# EasyEDA Pro project MSXLinkCart.V1.epro

# Schematic CartridgeBoard

## Sheets
1 Power Supply: Board Name: V1; Create Date: 2025-08-08; Page Name: Power Supply; Project Name: OpenMSXSimpleCart; Schematic Name: CartridgeBoard; Update Date: 2025-08-09; Company: geek-logic.com; Drawed: Wells Wang; Page Size: A4; Reviewed: Wells Wang; Version: V1.0
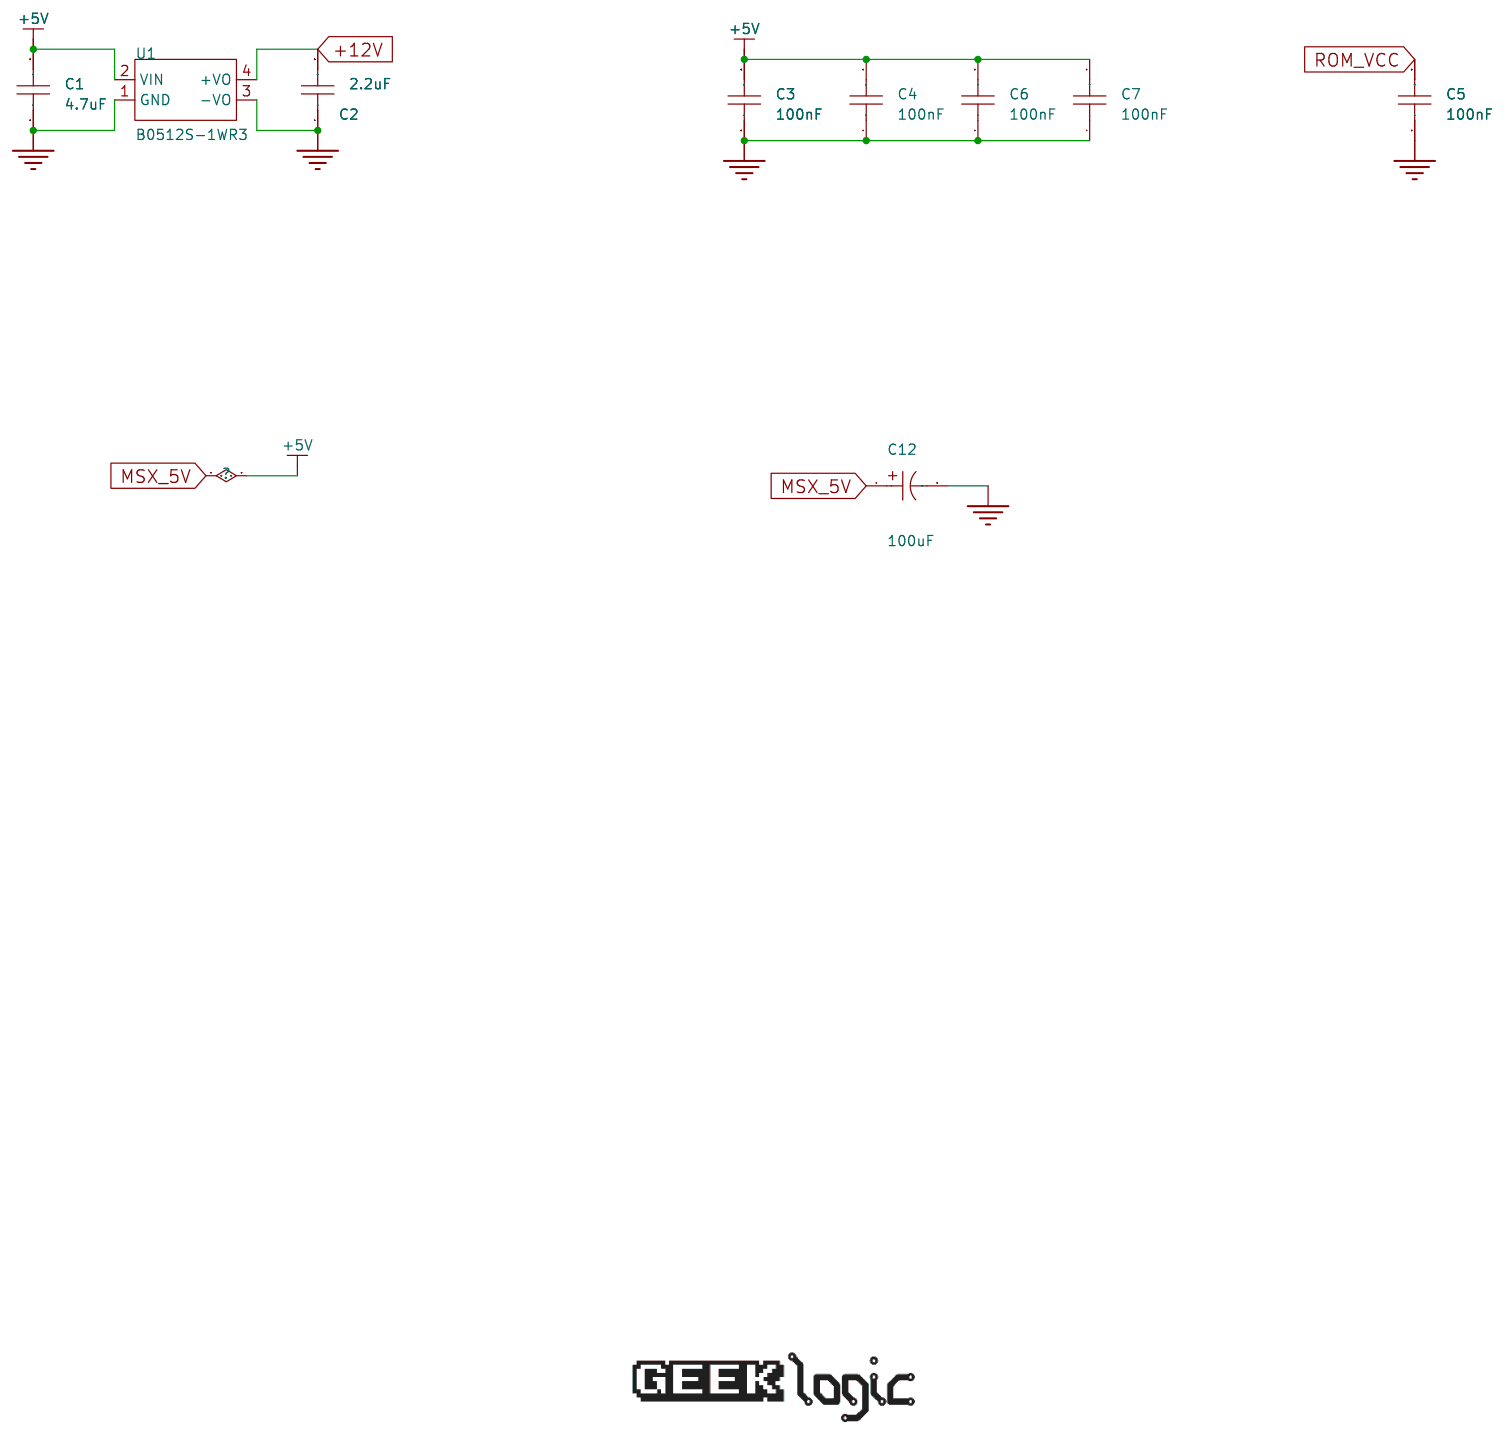
[diagram p0: Power Supply]
2 MCU: Page Name: MCU; Update Date: 2025-08-11
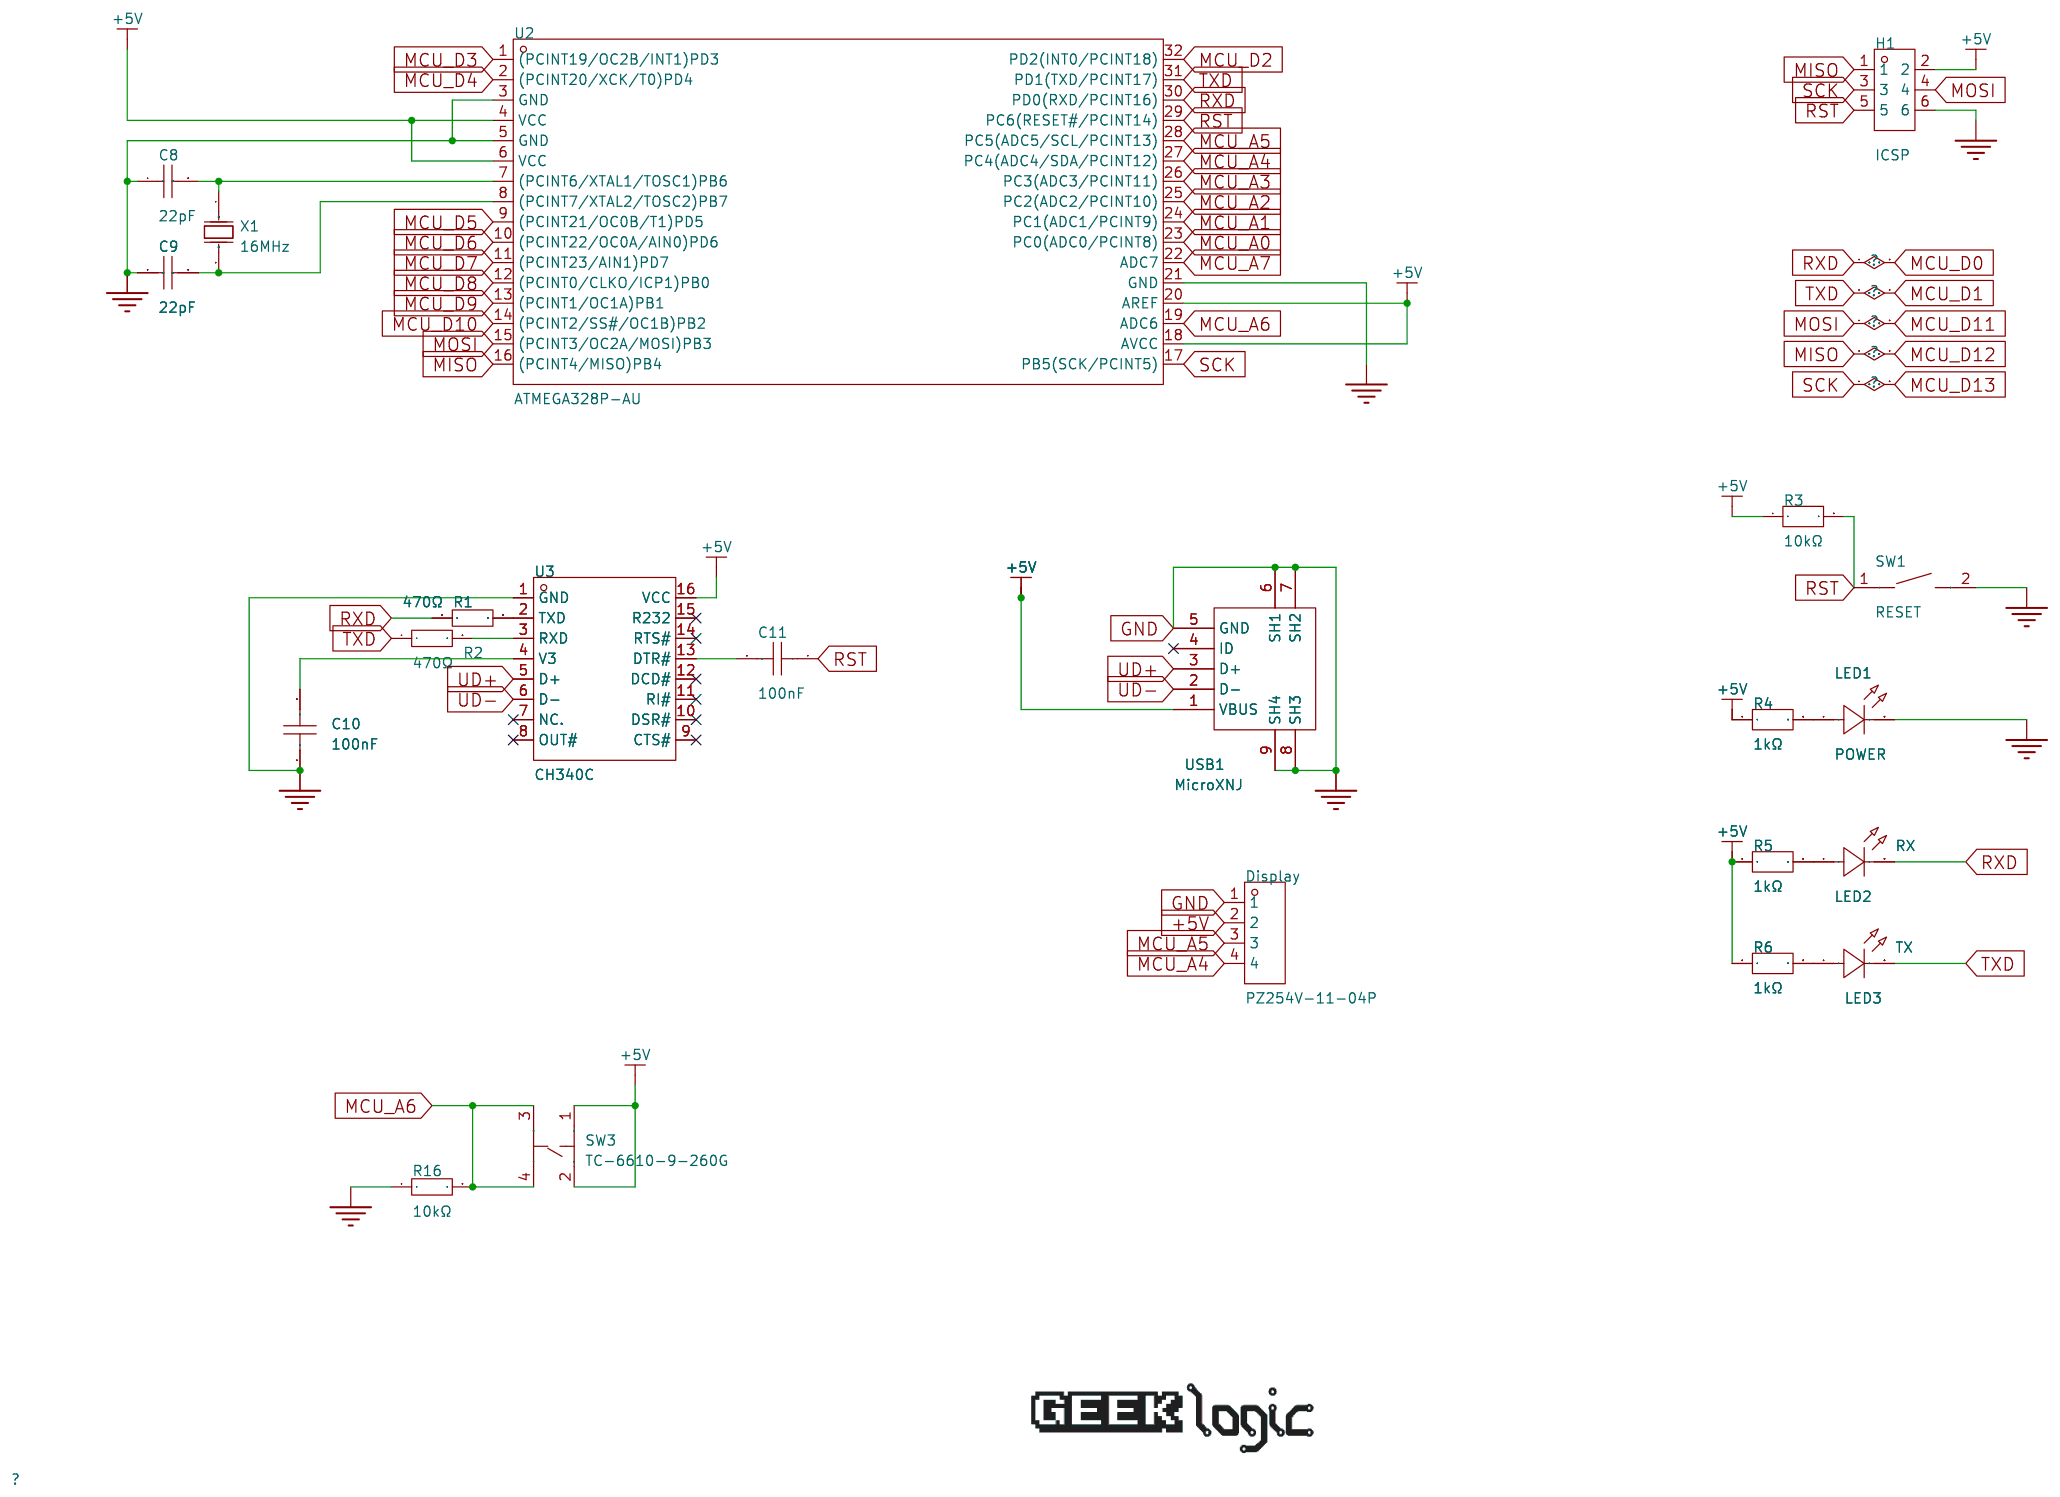
[diagram p1: MCU]
3 ROM: Page Name: ROM; Update Date: 2025-08-10
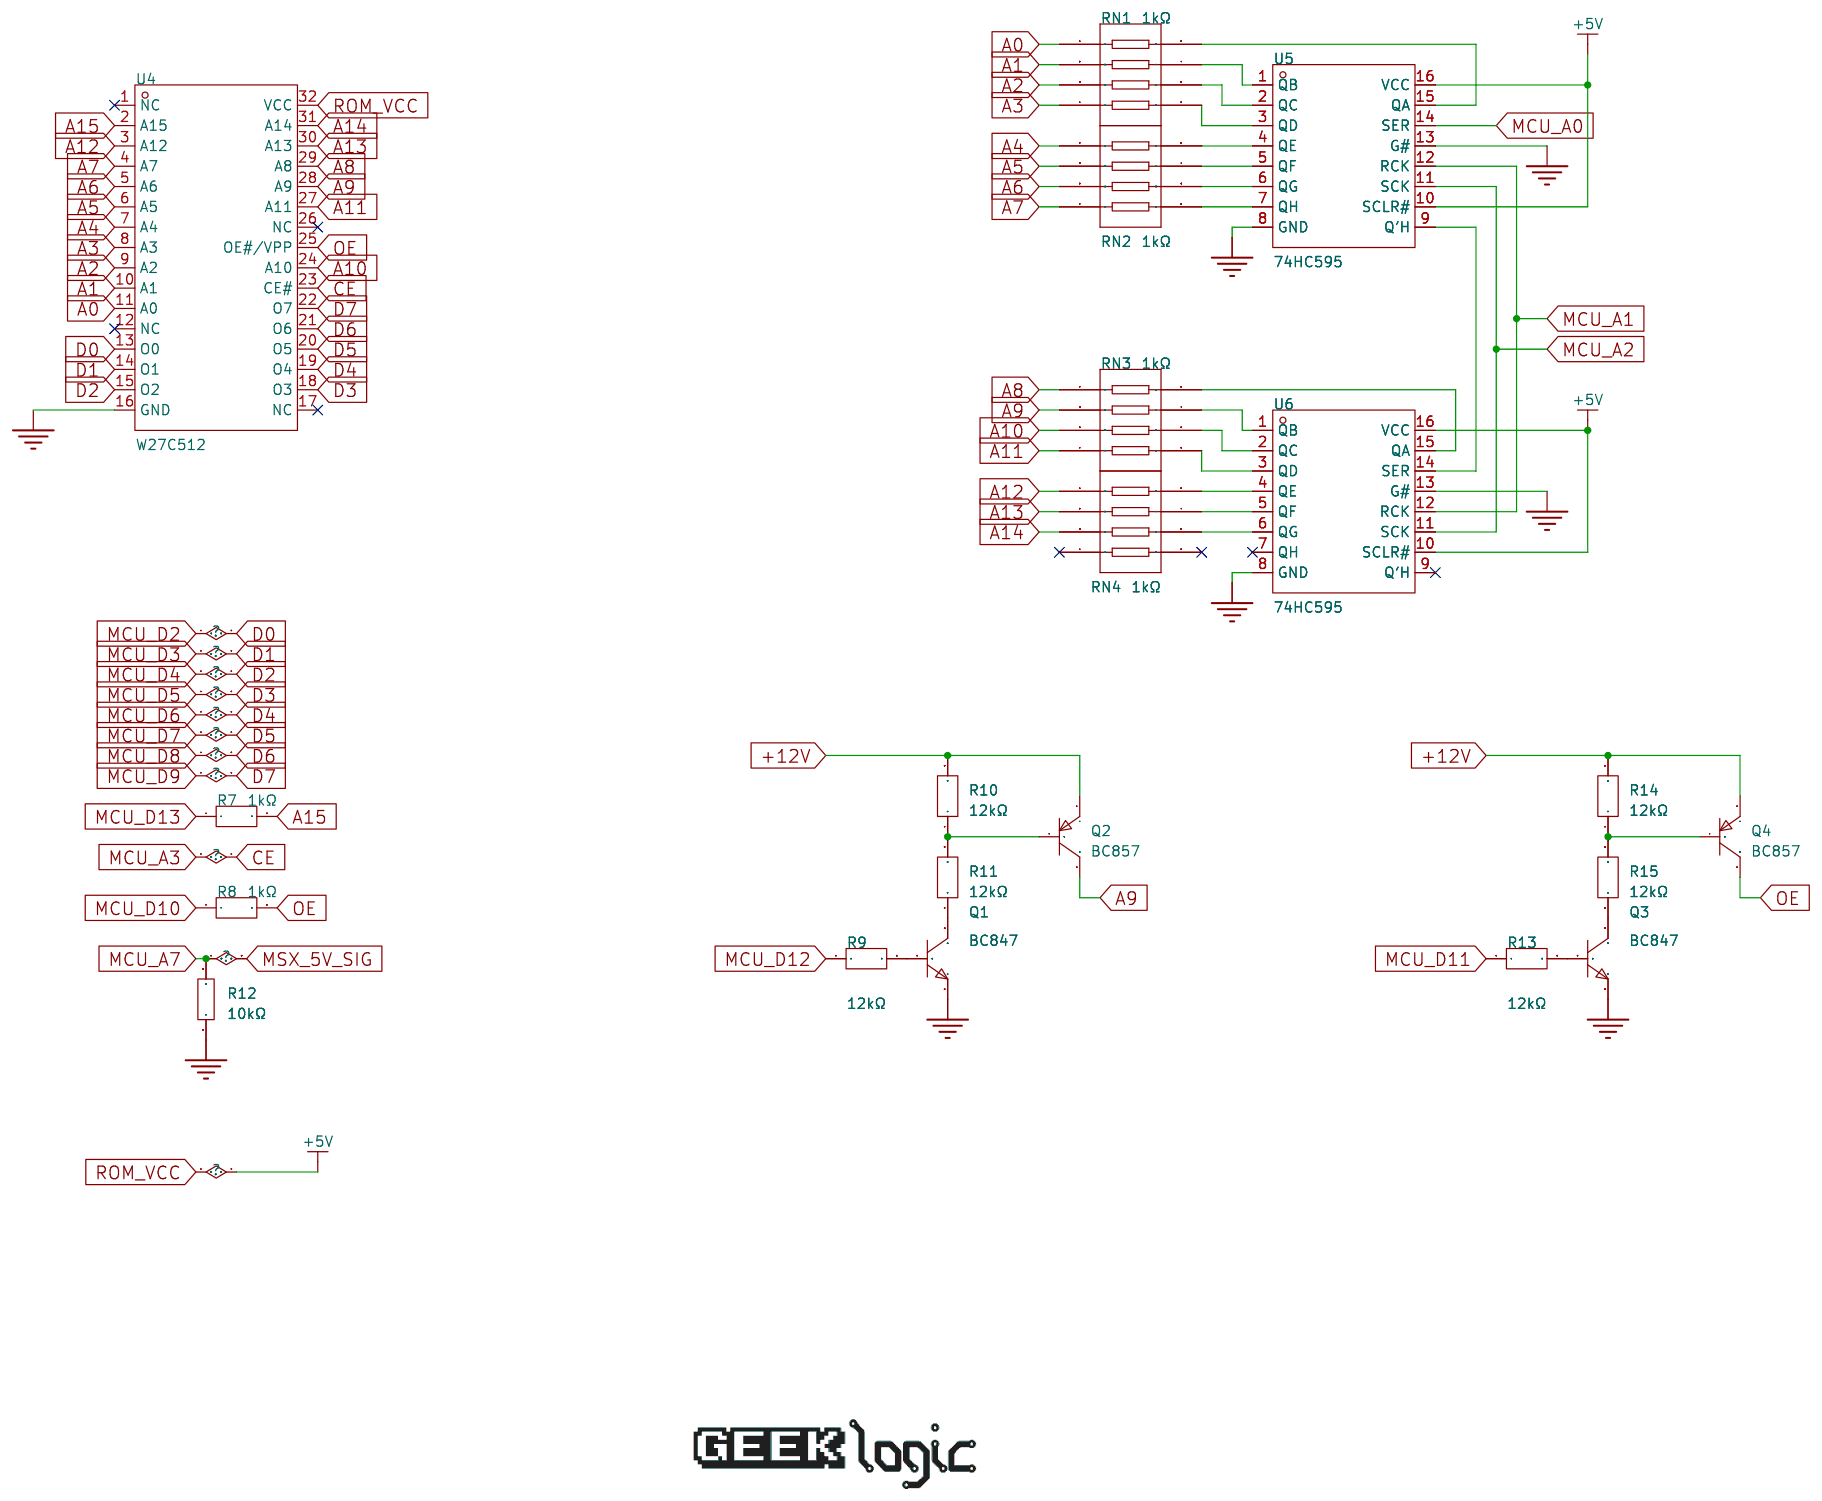
[diagram p2: ROM]
4 Slot Connector: Page Name: Slot Connector
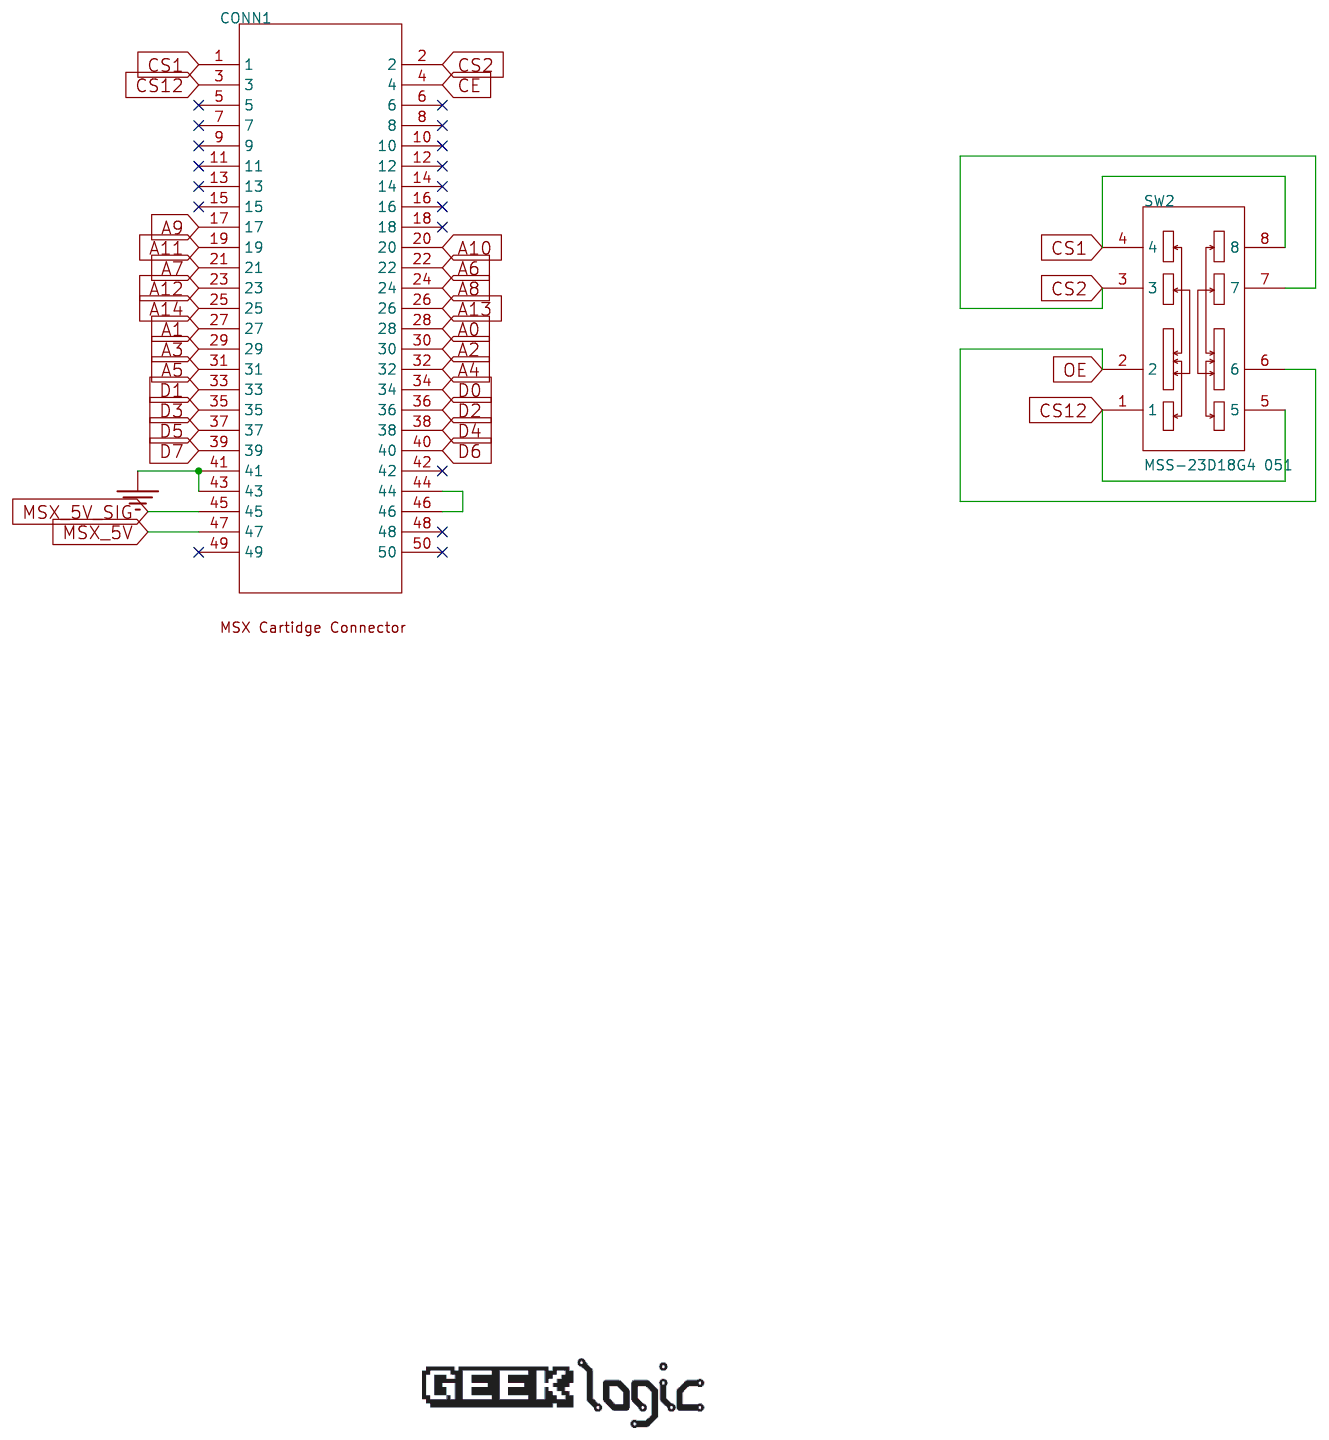
[diagram p3: Slot Connector]

## Parts
sheet MCU
C8  22pF  [C0805]
C9  22pF  [C0805]
C10  100nF  [C0805]
C11  100nF  [C0805]
Display  PZ254V-11-04P  [HDR-TH_4P-P2.54-V-M]
H1  ICSP  [HDR-TH_6P-P2.54-V-M-R2-C3-S2.54]
LED1  POWER  [LED0805-FD]
LED2  RX  [LED0805-FD]
LED3  TX  [LED0805-FD]
R1  470Ω  [R0805]
R2  470Ω  [R0805]
R3  10kΩ  [R0805]
R4  1kΩ  [R0805]
R5  1kΩ  [R0805]
R6  1kΩ  [R0805]
R16  10kΩ  [R0805]
SW1  RESET  [SW-SMD_L3.9-W3.0-P4.45]
SW3  TC-6610-9-260G  [SW-TH_4P-L5.0-W5.0-P4.50-LS6.5]
U2  ATMEGA328P-AU  [TQFP-32_L7.0-W7.0-P0.80-LS9.0-BL]
U3  CH340C  [SOP-16_L10.0-W3.9-P1.27-LS6.0-BL]
USB1  MicroXNJ  [MICRO-USB-SMD_MICROXNJ]
X1  16MHz  [OSC-TH_L10.0-W4.5-P5.00]
sheet Power Supply
C1  4.7uF  [C0805]
C2  2.2uF  [C0805]
C3  100nF  [C0805]
C4  100nF  [C0805]
C5  100nF  [C0805]
C6  100nF  [C0805]
C7  100nF  [C0805]
C12  100uF  [CAP-SMD_BD6.3-L6.6-W6.6-LS7.6-FD-1]
U1  B0512S-1WR3  [PWRM-TH_4P-L11.5-W6.1-P2.54_TME1212S]
sheet ROM
Q1  BC847  [SOT-23-3_L2.9-W1.3-P1.90-LS2.4-BR]
Q2  BC857  [SOT-23-3_L2.9-W1.3-P1.90-LS2.4-BR]
Q3  BC847  [SOT-23-3_L2.9-W1.3-P1.90-LS2.4-BR]
Q4  BC857  [SOT-23-3_L2.9-W1.3-P1.90-LS2.4-BR]
R7  1kΩ  [R0805]
R8  1kΩ  [R0805]
R9  12kΩ  [R0805]
R10  12kΩ  [R0805]
R11  12kΩ  [R0805]
R12  10kΩ  [R0805]
R13  12kΩ  [R0805]
R14  12kΩ  [R0805]
R15  12kΩ  [R0805]
RN1  1kΩ  [RES-ARRAY-SMD_0603-8P-L3.2-W1.6-BL]
RN2  1kΩ  [RES-ARRAY-SMD_0603-8P-L3.2-W1.6-BL]
RN3  1kΩ  [RES-ARRAY-SMD_0603-8P-L3.2-W1.6-BL]
RN4  1kΩ  [RES-ARRAY-SMD_0603-8P-L3.2-W1.6-BL]
U4  W27C512  [PLCC-32_L14.0-W11.4-P1.27-LS15.0-T]
U5  74HC595  [SOP-16_L9.9-W3.9-P1.27-LS6.0-BL]
U6  74HC595  [SOP-16_L9.9-W3.9-P1.27-LS6.0-BL]
sheet Slot Connector
CONN1  -  [MSX 50PIN EDGE CONNECTOR]
SW2  MSS-23D18G4 051  [SW-TH_HX-MSS-23D18GX051]

## Library data of the parts
C8 C9 = CL21C220JBANNNC: 容值:22pF;精度:±5%;额定电压:50V;材质(温度系数):C0G;; LCSC Part Name: 22pF ±5% 50V; Supplier Part: C1804; Manufacturer: SAMSUNG(三星); Supplier Footprint: 0805; JLCPCB Part Class: 基础库; Datasheet: https://atta.szlcsc.com/upload/public/pdf/source/20160218/1457707763339.pdf; Supplier: LCSC; Tolerance: ±5%; Voltage Rated: 50V; Temperature Coefficient: C0G
C3-C7 C10 C11 = FCC0805B104K500DT: 容值:100nF;精度:±10%;额定电压:50V;温度系数:X7R;; LCSC Part Name: 100nF ±10% 50V; Supplier Part: C5137467; Manufacturer: FOJAN(富捷); Supplier Footprint: 0805; JLCPCB Part Class: 扩展库; Datasheet: https://atta.szlcsc.com/upload/public/pdf/source/20220818/0EB3B7FB2F5648AC16609637FBA7DABE.pdf; Supplier: LCSC; Tolerance: ±10%; Voltage Rating: 50V; Temperature Coefficient: X7R
Display = PZ254V-11-04P: 插针结构:1x4P;间距:2.54mm;行距:-;圆针/方针:方针;安装类型:直插;排数:单排;总PIN位数:4P;额定电流:3A;额定电压:250V;配合针长度:6mm;塑高:2.5mm;端接针长度:3mm;触头材质:-;工作温度范围:-40℃~+105℃;颜色:黑色;; LCSC Part Name: 间距:2.54mm 1x4P 直插 方针; Supplier Part: C2691448; Manufacturer: XFCN(兴飞); Supplier Footprint: 插件,P=2.54mm; JLCPCB Part Class: 扩展库; Datasheet: https://atta.szlcsc.com/upload/public/pdf/source/20200309/C492403_F9F19131791D08044AD4F84F8E751A34.pdf; Supplier: LCSC; Pin Structure: 1x4P; Pitch: 2.54mm; Circluar Pins/Square Pins: 方针; Mounting Type: 直插; Number of Rows: 单排; Number of Pins: 4P; Current Rating (Max): 3A; Voltage Rating (Max): 250V; Length of Mating Pin: 6mm; Insulation Height: 2.5mm; Length of End Connection Pin: 3mm; Operating Temperature Range: -40℃~+105℃; Color: 黑色
H1 = PZ254V-12-6P: 插针结构:2x3P;间距:2.54mm;行距:2.54mm;圆针/方针:方针;安装类型:直插;排数:双排;总PIN位数:6P;额定电流:-;额定电压:-;配合针长度:6mm;塑高:2.5mm;端接针长度:3mm;触头材质:黄铜;触头镀层:-;工作温度范围:-40℃~+105℃;颜色:黑色;; LCSC Part Name: 间距:2.54mm 2x3P 直插 方针; Supplier Part: C492420; Manufacturer: XFCN(兴飞); Supplier Footprint: 插件,P=2.54mm; JLCPCB Part Class: 扩展库; Datasheet: https://atta.szlcsc.com/upload/public/pdf/source/20200309/C492420_BAECB307B001054C09D200388220EAE6.pdf; Supplier: LCSC; Pin Structure: 2x3P; Pitch: 2.54mm; Row Spacing: 2.54mm; Circluar Pins/Square Pins: 方针; Mounting Type: 直插; Number of Rows: 双排; Number of Pins: 6P; Length of Mating Pin: 6mm; Insulation Height: 2.5mm; Length of End Connection Pin: 3mm; Contact Material: 黄铜; Operating Temperature Range: -40℃~+105℃; Color: 黑色
LED1-LED3 = 17-21/GHC-XS1T2M/4T: Supplier Part: C2971978; Manufacturer: EVERLIGHT(亿光); Supplier Footprint: 0805; JLCPCB Part Class: 扩展库; Supplier: LCSC
R1 R2 = 0805W8F4700T5E: 电阻类型:厚膜电阻;阻值:470Ω;精度:±1%;功率:125mW;最大工作电压:150V;温度系数:±100ppm/℃;; LCSC Part Name: 470Ω ±1% 125mW 厚膜电阻; Supplier Part: C17710; Manufacturer: UNI-ROYAL(厚声); Supplier Footprint: 0805; JLCPCB Part Class: 基础库; Datasheet: https://atta.szlcsc.com/upload/public/pdf/source/20200306/C422600_1E6D84923E4A46A82E41ADD87F860B5C.pdf; Supplier: LCSC; Type: 厚膜电阻; Tolerance: ±1%; Power(Watts): 125mW; Overload Voltage (Max): 150V; Temperature Coefficient: ±100ppm/℃; Operating Temperature Range: -55℃~+155℃
R3 = ERJ-U06F1002V: 电阻类型:厚膜电阻;阻值:10kΩ;精度:±1%;功率:125mW;工作电压:-;温度系数:±100ppm/℃;; LCSC Part Name: 10kΩ ±1% 125mW 厚膜电阻; Supplier Part: C1013448; Manufacturer: PANASONIC(松下); Supplier Footprint: 0805; JLCPCB Part Class: Extended Part; Datasheet: https://atta.szlcsc.com/upload/public/pdf/source/20210606/C1013448_67383767FD3F9FEFE543BB803CCD7A76.pdf; Supplier: LCSC; Type: 厚膜电阻; Tolerance: ±1%; Power(Watts): 125mW; Temperature Coefficient: ±100ppm/℃; Operating Temperature: -55℃~+155℃
R4-R8 = ERJ-U06F1001V: 电阻类型:厚膜电阻;阻值:1kΩ;精度:±1%;功率:125mW;温度系数:±100ppm/℃;; LCSC Part Name: 1kΩ ±1% 125mW 厚膜电阻; Supplier Part: C4026491; Manufacturer: PANASONIC(松下); Supplier Footprint: 0805; JLCPCB Part Class: Extended Part; Datasheet: https://atta.szlcsc.com/upload/public/pdf/source/20240408/99A45AC14EAA6AC337D556AA79AC87B5.pdf; Supplier: LCSC; Type: 厚膜电阻; Tolerance: ±1%; Power(Watts): 125mW; Temperature Coefficient: ±100ppm/℃; Operating Temperature: -55℃~+155℃
R12 R16 = 0805W8F1002T5E_C17414: 电阻类型:厚膜电阻;阻值:10kΩ;精度:±1%;功率:125mW;工作电压:150V;温度系数:±100ppm/℃;; LCSC Part Name: 10kΩ ±1% 125mW 厚膜电阻; Supplier Part: C17414; Manufacturer: UNI-ROYAL(厚声); Manufacturer Part: 0805W8F1002T5E; Supplier Footprint: 0805; JLCPCB Part Class: 基础库; Datasheet: https://atta.szlcsc.com/upload/public/pdf/source/20200306/C422600_1E6D84923E4A46A82E41ADD87F860B5C.pdf; Supplier: LCSC; Type: 厚膜电阻; Tolerance: ±1%; Power(Watts): 125mW; Voltage-Supply(Max): 150V; Temperature Coefficient: ±100ppm/℃; Operating Temperature: -55℃~+155℃
SW1 = TS-1088-AR02016: 电路结构:单刀单掷;按钮形状:圆形按钮;作用力:160gf;安装方式:立贴;开关长度:4mm;开关宽度:3mm;开关高度:2mm;带支架:不带;触点电流:50mA;额定电压(DC):12V;绝缘电阻:100MΩ;机械寿命:10万次;; LCSC Part Name: 4*3*2mm 立贴 轻触开关; Supplier Part: C720477; Manufacturer: XUNPU(讯普); Supplier Footprint: SMD; JLCPCB Part Class: 基础库; Datasheet: https://atta.szlcsc.com/upload/public/pdf/source/20200810/C720475_60D09DD6C54279ADDB2DC25100F1CC11.pdf; Supplier: LCSC; Circuit: 单刀单掷; Actuator Style: 圆形按钮; Operating Force: 160gf; Mounting Style: 立贴; Switch Length: 4mm; Switch Width: 3mm; Switch Height: 2mm; Strike Gundam: 不带; Contact Current: 50mA; Voltage Rating (DC): 12V; Insulation Resistance: 100MΩ; Actuator/Cap Color: 黑色; Pin Style: SMD接片; Mechanical Life: 10万次; Operating Temperature: -30℃~+80℃
SW3 = TC-6610-9-260G: 电路结构:单刀单掷;按钮形状:圆形按钮;作用力:2.6N;安装方式:直插;开关长度:6mm;开关宽度:6mm;开关高度:9mm;带支架:不带支架;触点电流:50mA;额定电压:12V;带灯:无;工作寿命:10万次;; LCSC Part Name: 6*6*9mm 插件 轻触开关; Supplier Part: C2845257; Manufacturer: HCTL(华灿天禄); Supplier Footprint: 插件; JLCPCB Part Class: 扩展库; Datasheet: https://atta.szlcsc.com/upload/public/pdf/source/20230323/2FDB5D6FCE87B7593CD3E5FAC75F65D7.pdf; Supplier: LCSC; Circuit: 单刀单掷; Actuator Style: 圆形按钮; Operating Force: 2.6N; Mounting Type: 直插; Length: 6mm; Width: 6mm; Switch Height: 9mm; Strike Gundam: 不带支架; Contact Current: 50mA; Voltage Rating: 12V; Actuator/Cap Color: 黑色; With Lamp: 无; Termination Style: PC引脚; Life: 10万次; Operating Temperature: -25℃~+85℃
U2 = ATMEGA328P-AU: CPU内核:AVR;CPU最大主频:20MHz;应用领域:-;; LCSC Part Name: 基于AVR增强型RISC架构的低功耗CMOS 8位微控制器; Supplier Part: C14877; Manufacturer: MICROCHIP(美国微芯); Supplier Footprint: TQFP-32(7x7); JLCPCB Part Class: 扩展库; Datasheet: https://atta.szlcsc.com/upload/public/pdf/source/20140621/1457707095197.pdf; Supplier: LCSC; CPU Core: AVR; CPU Maximum Speed: 20MHz; Program Storage Size: 32KB; Program Memory Type: FLASH; EEPROM: 1KB; Number of I/O: 23; ADC (Bit): 10bit; Voltage - Supply: 1.8V~5.5V
U3 = CH340C: 应用功能:收发器;接口协议:USB 2.0;数据速率:2Mbps;; Supplier Part: C84681; Manufacturer: WCH(南京沁恒); Supplier Footprint: SOP-16; JLCPCB Part Class: 扩展库; Datasheet: https://atta.szlcsc.com/upload/public/pdf/source/20240619/63986D8440D4E5267A77ACD891CC4DE3.pdf; Supplier: LCSC; Applications Function: 收发器; Protocol: USB 2.0; Voltage - Supply: 3.3V；5V; Data Rate: 2Mbps
USB1 = MicroXNJ: 连接器类型:Micro-B;标准:USB 2.0;公母:母;安装方式:卧贴;触点数量:5P;端口数量:1;额定电流 - 电源:1.8A;工作温度范围:-20℃~+85℃;; LCSC Part Name: Micro-B 母 卧贴; Supplier Part: C404969; Manufacturer: SHOU HAN(首韩); Supplier Footprint: SMD; JLCPCB Part Class: 扩展库; Datasheet: https://atta.szlcsc.com/upload/public/pdf/source/20220415/2494EDFF499AF6F852F7C820374B6AF3.pdf; Supplier: LCSC; Connector Type: Micro-B; Standard: USB 2.0; Gender: 母; Mounting Style: 卧贴; Number of Contacts: 5P; Number of Ports: 1; Current Rating - Power (Max): 1.8A; Operating Temperature Range: -20℃~+85℃; Rated Voltage (Max): 30V; Connect-Disconnect Life: 5千次; Core Colour: 黑色
X1 = X49SD16MSD2SC: 晶振类型:直插晶振;频率:16MHz;常温频差:±20ppm;负载电容:20pF;频率稳定度:±30ppm;; LCSC Part Name: HC-49US 16MHZ 2P 49S 20PF ±20PPM -20~70℃ (±30PPM); Supplier Part: C16212; Manufacturer: YXC(扬兴晶振); Supplier Footprint: HC-49S; JLCPCB Part Class: 扩展库; Datasheet: https://atta.szlcsc.com/upload/public/pdf/source/20240329/977D7F2434F98B2BE33270BB9FF3D86D.pdf; Supplier: LCSC; Type: 直插晶振; Normal temperature Frequency Tolerance: ±20ppm; Load Capacitance: 20pF; Frequency Stability: ±30ppm; Operating Temperature: -20℃~+70℃
C1 = CGA0805X7R475K350MT: 容值:4.7uF;精度:±10%;额定电压:35V;材质(温度系数):X7R;; LCSC Part Name: 4.7uF ±10% 35V; Supplier Part: C6119943; Manufacturer: HRE(芯声); Supplier Footprint: 0805; JLCPCB Part Class: 扩展库; Supplier: LCSC; Tolerance: ±10%; Voltage Rated: 35V; Temperature Coefficient: X7R
C2 = CL21A225KBQNNNE: 容值:2.2uF;精度:±10%;额定电压:50V;材质(温度系数):X5R;; LCSC Part Name: 2.2uF ±10% 50V; Supplier Part: C377773; Manufacturer: SAMSUNG(三星); Supplier Footprint: 0805; JLCPCB Part Class: 基础库; Datasheet: https://atta.szlcsc.com/upload/public/pdf/source/20160218/1457707763339.pdf; Supplier: LCSC; Tolerance: ±10%; Voltage Rated: 50V; Temperature Coefficient: X5R
C12 = RVE100UF35V67RV0072: 容值:100uF;精度:±20%;额定电压:35V;纹波电流:230mA@120Hz;等效串联电阻:600mΩ@100kHz;; LCSC Part Name: 100uF ±20% 35V; Supplier Part: C2836437; Manufacturer: KNSCHA(科尼盛); Supplier Footprint: SMD,D6.3xL7.7mm; JLCPCB Part Class: 扩展库; Datasheet: https://atta.szlcsc.com/upload/public/pdf/source/20220719/B52EB46F8A1558448ED03D8B4CB3C24F.pdf; Supplier: LCSC; Tolerance: ±20%; Rated Voltage: 35V; Ripple Current: 230mA@120Hz; Equivalent Series Resistance(ESR): 600mΩ@100kHz; φD: 6.3mm; L: 7.7mm; Lifetime @ Temp: 2000hrs@105℃; Operating Temperature: -55℃~+105℃
U1 = B0512S-1WR3: B0512S-1WR3小体积,，高效率的微小功率,定电压输入,隔离非稳压单路输出,DC/DC模块电源；该系列产品是专门针对板上电源系统中需要产生一组与输入电源隔离的电压的应用场合而设计的。该产品适用于：1)输入电源的电压比较稳定（电压变化范围±10%Vin）;2)输入输出之间要求隔离（隔离电压≤1500VDC）；3)对输出电压稳定度要求不高；4)典型应用：纯数字电路场合，一般低频模拟电路场合，继电器驱动电路，数据交换电路场合等;; Supplier Part: C3031179; Manufacturer: YLPTEC(易川); Supplier Footprint: 插件; JLCPCB Part Class: 扩展库; Datasheet: https://atta.szlcsc.com/upload/public/pdf/source/20220507/D4A14754AF1A932D99A68D6BE212C636.pdf; Supplier: LCSC; Type: 升压型; Number of Channels: 1; Output Power: 1W; Voltage - Supply: 4.5V~5.5V; Conversion Efficiency: 89%; Output Voltage: 12V; Output Current(Max): 84mA; Capacitive Load(Max): 560uF; Isolation Voltage(Vrms): 1.5kV; Features: 短路保护；低功耗
Q1 Q3 = BC847: 晶体管类型:NPN;集电极电流(Ic):100mA;集射极击穿电压(Vceo):45V;功率(Pd):200mW;直流电流增益(hFE@Ic,Vce):110@2mA,5V;; LCSC Part Name: NPN 电流:100mA 耐压:45V; Supplier Part: C475630; Manufacturer: SHIKUES(时科); Supplier Footprint: SOT-23; JLCPCB Part Class: 扩展库; Datasheet: https://atta.szlcsc.com/upload/public/pdf/source/20200102/C475632_1BD5CEE5FD46587CE970DDC94CF96264.pdf; Supplier: LCSC; Transistor Type: NPN; Collector Current (Ic): 100mA; Collector-Emitter Breakdown Voltage (Vceo): 45V; Power Dissipation (Pd): 200mW; DC Current Gain (hFE@Ic,Vce): 110@2mA,5V; Transition Frequency (fT): 100MHz; Collector Cut-Off Current (Icbo): 100nA; Collector-Emitter Saturation Voltage (VCE(sat)@Ic,Ib): 500mV@100mA,5mA
Q2 Q4 = BC857: 晶体管类型:PNP;集电极电流(Ic):100mA;集射极击穿电压(Vceo):45V;功率(Pd):200mW;; LCSC Part Name: PNP 电流:100mA 耐压:45V; Supplier Part: C779725; Manufacturer: ZRE(治润); Supplier Footprint: SOT-23; JLCPCB Part Class: 扩展库; Datasheet: https://atta.szlcsc.com/upload/public/pdf/source/20201109/C779724_547EB5FA2CF407B243D5801159EBDFAB.pdf; Supplier: LCSC; Transistor Type: PNP; Collector Current (Ic): 100mA; Collector-Emitter Breakdown Voltage (Vceo): 45V; Power Dissipation (Pd): 200mW; Transition Frequency (fT): 100MHz; Collector Cut-Off Current (Icbo): 100nA; Collector-Emitter Saturation Voltage (VCE(sat)@Ic,Ib): 500mV@100mA,5mA
R9-R11 R13-R15 = ESR10EZPJ123: 电阻类型:厚膜电阻;阻值:12kΩ;精度:±5%;功率:400mW;最大工作电压:150V;温度系数:±200ppm/℃;; LCSC Part Name: 厚膜电阻 12kΩ ±5% 400mW; Supplier Part: C2077536; Manufacturer: ROHM(罗姆); Supplier Footprint: 0805; JLCPCB Part Class: 扩展库; Datasheet: https://atta.szlcsc.com/upload/public/pdf/source/20201013/C880931_34AADF1DD21EC1387392F0720F70D907.pdf; Supplier: LCSC; Type: 厚膜电阻; Tolerance: ±5%; Power(Watts): 400mW; Overload Voltage (Max): 150V; Temperature Coefficient: ±200ppm/℃; Operating Temperature Range: -55℃~+155℃
RN1-RN4 = 4D03WGJ0102T5E: 电阻器数:4;阻值:1kΩ;精度:±5%;单个元件功率:62.5mW;温度系数:±200ppm/℃;; LCSC Part Name: 1kΩ ±5%; Supplier Part: C20197; Manufacturer: UNI-ROYAL(厚声); Supplier Footprint: 0603x4; JLCPCB Part Class: 基础库; Datasheet: https://atta.szlcsc.com/upload/public/pdf/source/20191224/C474318_2527498AE30E813171187CCD28401A71.pdf; Supplier: LCSC; Number of Resistors: 4; Tolerance: ±5%; Power(Watts): 62.5mW; Temperature Coefficient: ±200ppm/℃; Number of Pins: 8
U4 = AT27C512R-45JU_C613963: AT27C512R是一款低功耗、高性能、524,288位、一次性可编程只读存储器（OTP EPROM），组织形式为64K x 8位。在正常读取模式操作中，它仅需一个5V电源。任何字节都可在小于45ns内访问，无需在高性能微处理器系统上使用降低速度的WAIT状态。; LCSC Part Name: AT27C512R-45JU; Supplier Part: C613963; Manufacturer: MICROCHIP(美国微芯); Supplier Footprint: PLCC-32(11.4x14); JLCPCB Part Class: 扩展库; Datasheet: https://item.szlcsc.com/datasheet/AT27C512R-45JU/643971.html; Supplier: LCSC
U5 U6 = 74HC595: 功能:串行至串行或并行;工作电压:2V~6V;元件数:1;每个元件位数:8;; Supplier Part: C18164493; Manufacturer: GR(国睿); Supplier Footprint: SOP-16; JLCPCB Part Class: 扩展库; Datasheet: https://atta.szlcsc.com/upload/public/pdf/source/20230915/F264A7C02E418D1689E15579DAA93EB8.pdf; Supplier: LCSC; Function: 串行至串行或并行; Supply Voltage: 2V~6V; Number of Elements: 1; Number of Bits per Element: 8; Output Type: 三态; Series: 74HC; Operating Temperature: -40℃~+85℃
CONN1 = MSX Cartridge Edge Connector
SW2 = MSS-23D18G4 051: 电路结构:双刀三掷;安装方式:直插;额定电流:100mA;额定电压:12V;工作寿命:1万次;; LCSC Part Name: 三档立式插件 8脚拨动 柄长4MM; Supplier Part: C7507436; Manufacturer: SHOU HAN(首韩); Supplier Footprint: DIP; JLCPCB Part Class: 扩展库; Datasheet: https://atta.szlcsc.com/upload/public/pdf/source/20250110/B51C719F20393CE8C900D786CCDBE29D.pdf; Supplier: LCSC; Circuit: 双刀三掷; Actuator Style: 矩形柱状; Termination Style: PC引脚; Mounting Type: 直插; Current Rating: 100mA; Voltage Rating: 12V; Life: 1万次; Operating Temperature: -10℃~+50℃

## Nets
+5V: C1.2 C3.2 C4.2 C5.2 C6.2 C7.2 C12.1 CONN1.47 Display.2 H1.2 R3.1 R4.1 R5.1 R6.1 SW3.1 SW3.2 U1.2(VIN) U2.4(VCC) U2.6(VCC) U2.18(AVCC) U2.20(AREF) U3.16(VCC) U4.32(VCC) U5.10(SCLR#) U5.16(VCC) U6.10(SCLR#) U6.16(VCC) USB1.1(VBUS)
+12V: C2.2 Q2.2(E) Q4.2(E) R10.2 R14.2 U1.4(+VO)
GND: C1.1 C2.1 C3.1 C4.1 C5.1 C6.1 C7.1 C8.1 C9.1 C10.1 C12.2 CONN1.41 CONN1.43 Display.1 H1.6 LED1.2(K) Q1.2(E) Q3.2(E) R12.1 R16.1 SW1.2 U1.1(GND) U1.3(-VO) U2.3(GND) U2.5(GND) U2.21(GND) U3.1(GND) U4.16(GND) U5.8(GND) U5.13(G#) U6.8(GND) U6.13(G#) USB1.5(GND) USB1.6(SH1) USB1.7(SH2) USB1.8(SH3) USB1.9(SH4)
A0: CONN1.28 RN1.1 U4.11(A0)
A1: CONN1.27 RN1.2 U4.10(A1)
A2: CONN1.30 RN1.3 U4.9(A2)
A3: CONN1.29 RN1.4 U4.8(A3)
A4: CONN1.32 RN2.1 U4.7(A4)
A5: CONN1.31 RN2.2 U4.6(A5)
A6: CONN1.22 RN2.3 U4.5(A6)
A7: CONN1.21 RN2.4 U4.4(A7)
A8: CONN1.24 RN3.1 U4.29(A8)
A9: CONN1.17 Q2.3(C) RN3.2 U4.28(A9)
A10: CONN1.20 RN3.3 U4.24(A10)
A11: CONN1.19 RN3.4 U4.27(A11)
A12: CONN1.23 RN4.1 U4.3(A12)
A13: CONN1.26 RN4.2 U4.30(A13)
A14: CONN1.25 RN4.3 U4.31(A14)
A15: R7.2 U4.2(A15)
CE: CONN1.4 U2.26(PC3(ADC3/PCINT11)) U4.23(CE#)
CS1: CONN1.1 SW2.4 SW2.8
CS2: CONN1.2 SW2.3 SW2.7
CS12: CONN1.3 SW2.1 SW2.5
D0: CONN1.34 U2.32(PD2(INT0/PCINT18)) U4.13(O0)
D1: CONN1.33 U2.1((PCINT19/OC2B/INT1)PD3) U4.14(O1)
D2: CONN1.36 U2.2((PCINT20/XCK/T0)PD4) U4.15(O2)
D3: CONN1.35 U2.9((PCINT21/OC0B/T1)PD5) U4.18(O3)
D4: CONN1.38 U2.10((PCINT22/OC0A/AIN0)PD6) U4.19(O4)
D5: CONN1.37 U2.11((PCINT23/AIN1)PD7) U4.20(O5)
D6: CONN1.40 U2.12((PCINT0/CLKO/ICP1)PB0) U4.21(O6)
D7: CONN1.39 U2.13((PCINT1/OC1A)PB1) U4.22(O7)
MCU_A0: U2.23(PC0(ADC0/PCINT8)) U5.14(SER)
MCU_A1: U2.24(PC1(ADC1/PCINT9)) U5.12(RCK) U6.12(RCK)
MCU_A2: U2.25(PC2(ADC2/PCINT10)) U5.11(SCK) U6.11(SCK)
MCU_A4: Display.4 U2.27(PC4(ADC4/SDA/PCINT12))
MCU_A5: Display.3 U2.28(PC5(ADC5/SCL/PCINT13))
MCU_A6: R16.2 SW3.3 SW3.4 U2.19(ADC6)
MCU_A7: CONN1.45 R12.2 U2.22(ADC7)
MCU_D0: LED2.2(K) R1.1 U2.30(PD0(RXD/PCINT16))
MCU_D1: LED3.2(K) R2.1 U2.31(PD1(TXD/PCINT17))
MCU_D10: R8.1 U2.14((PCINT2/SS#/OC1B)PB2)
MCU_D11: H1.4 R13.1 U2.15((PCINT3/OC2A/MOSI)PB3)
MCU_D12: H1.1 R9.1 U2.16((PCINT4/MISO)PB4)
MCU_D13: H1.3 R7.1 U2.17(PB5(SCK/PCINT5))
OE: Q4.3(C) R8.2 SW2.2 SW2.6 U4.25(OE#/VPP)
RST: C11.1 H1.5 R3.2 SW1.1 U2.29(PC6(RESET#/PCINT14))
UD+: U3.5(D+) USB1.3(D+)
UD-: U3.6(D-) USB1.2(D-)
$3N645: R1.2 U3.2(TXD)
$3N684: R2.2 U3.3(RXD)
$3N1092: C8.2 U2.7((PCINT6/XTAL1/TOSC1)PB6) X1.1(OSC1)
$3N1096: C9.2 U2.8((PCINT7/XTAL2/TOSC2)PB7) X1.2(OSC2)
$3N2382: C10.2 U3.4(V3)
$3N2455: C11.2 U3.13(DTR#)
$4N1047: U5.9(Q′H) U6.14(SER)
$4N1502: RN1.8 U5.15(QA)
$4N2627: Q2.1(B) R10.1 R11.2
$4N2636: Q1.3(C) R11.1
$4N2638: Q1.1(B) R9.2
$4N3090: Q4.1(B) R14.1 R15.2
$4N3092: Q3.3(C) R15.1
$4N3094: Q3.1(B) R13.2
$4N6754: RN3.8 U6.15(QA)
$4N6776: RN2.8 U5.4(QE)
$4N6780: RN2.7 U5.5(QF)
$4N6785: RN2.6 U5.6(QG)
$4N6790: RN2.5 U5.7(QH)
$4N6819: RN1.5 U5.3(QD)
$4N6825: RN1.6 U5.2(QC)
$4N6841: RN1.7 U5.1(QB)
$4N6896: RN3.5 U6.3(QD)
$4N6902: RN3.6 U6.2(QC)
$4N6909: RN3.7 U6.1(QB)
$4N6933: RN4.8 U6.4(QE)
$4N6938: RN4.7 U6.5(QF)
$4N6943: RN4.6 U6.6(QG)
$5N778: CONN1.44 CONN1.46
Net-(LED1-1): LED1.1(A) R4.2
Net-(LED2-1): LED2.1(A) R5.2
Net-(LED3-1): LED3.1(A) R6.2

Not connected (* = marked no-connect by the designer): CONN1 5* 6* 7* 8* 9* 10* 11* 12* 13* 14* 15* 16* 18* 42* 48* 49* 50*; RN4 4* 5*; U3 7(NC.)* 8(OUT#)* 9(CTS#)* 10(DSR#)* 11(RI#)* 12(DCD#)* 14(RTS#)* 15(R232)*; U4 1(NC)* 12(NC)* 17(NC)* 26(NC)*; U6 7(QH)* 9(Q′H)*; USB1 4(ID)*

# Board CartridgeBoard
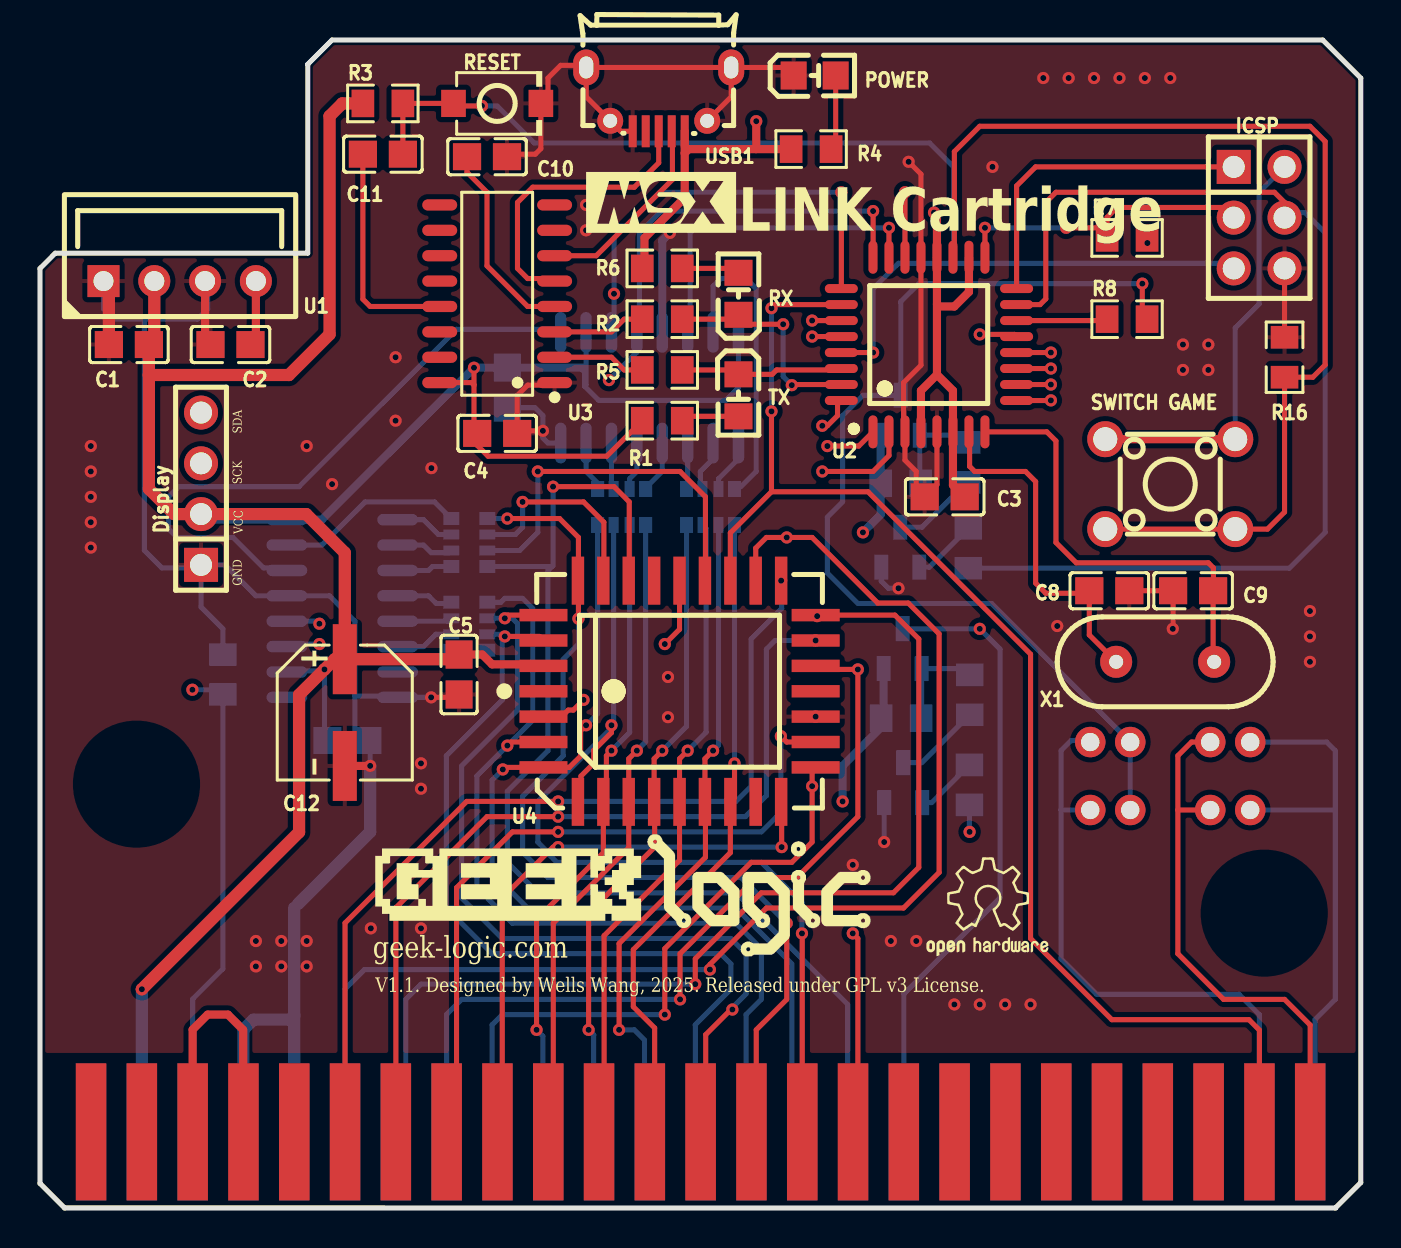
[diagram p4: board, top side]
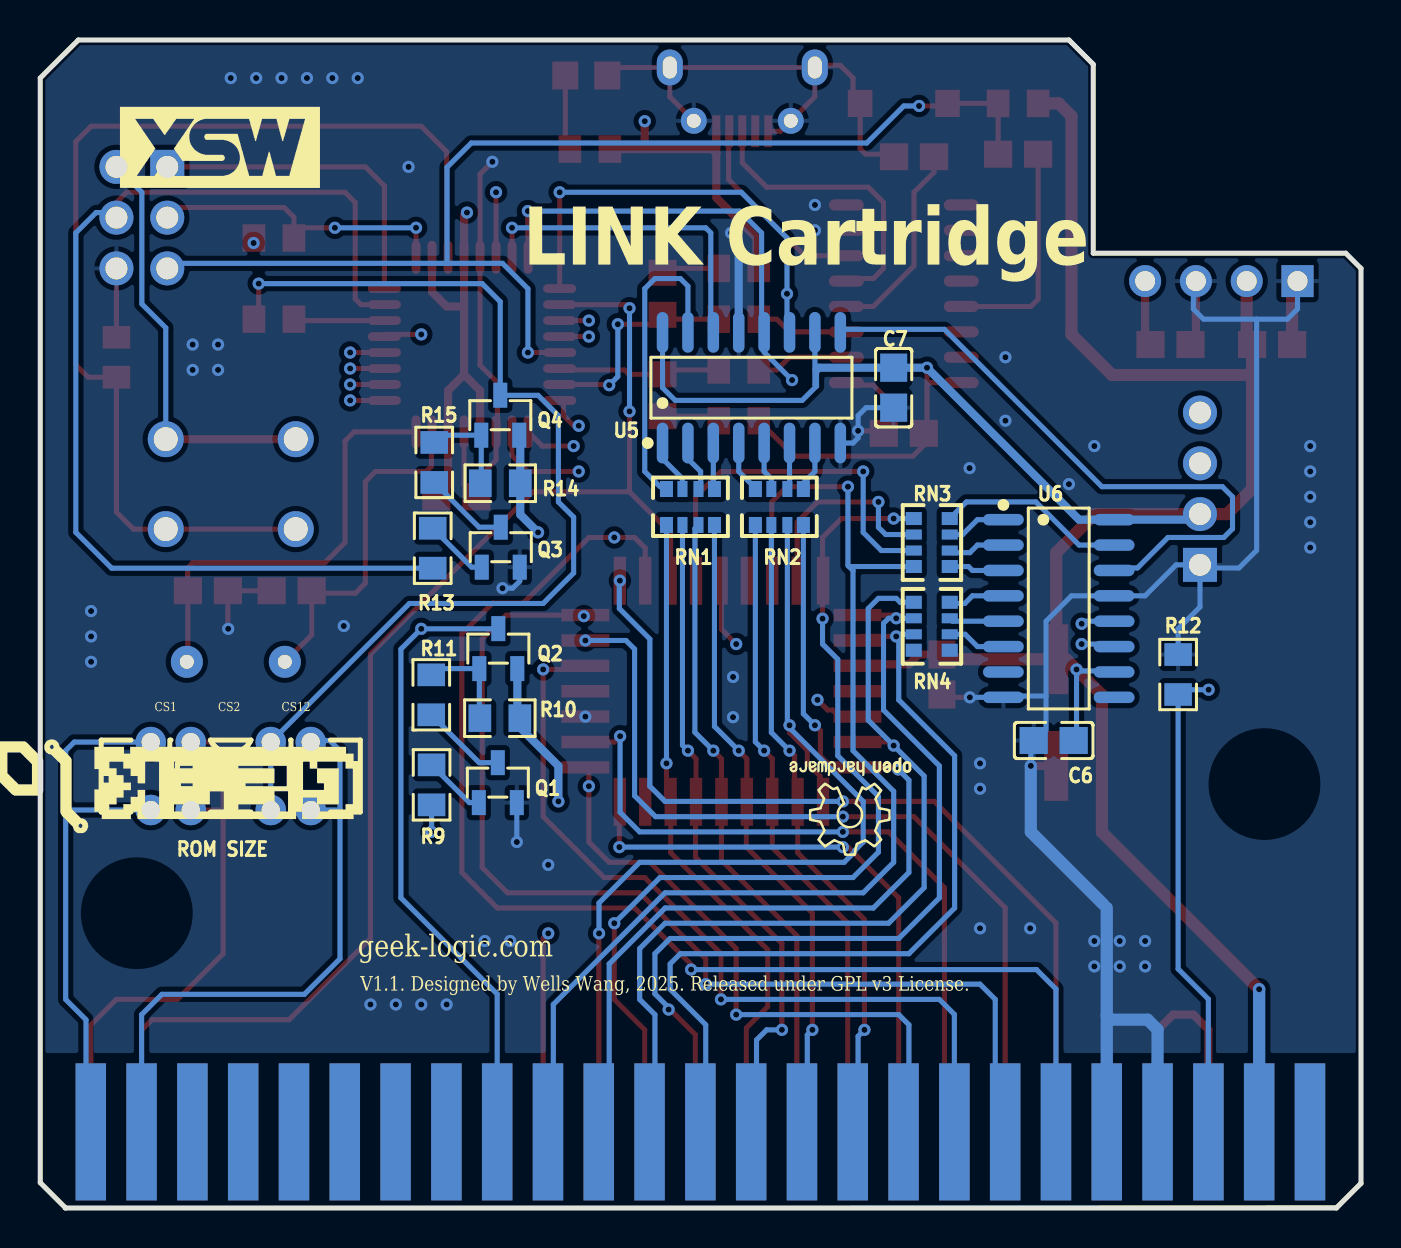
[diagram p5: board, bottom side, seen from below]

Outline 66.05 x 58.45 mm; copper layers: Top Layer, Inner1, Inner2, Bottom Layer. Coordinates in mm from the lower left corner of the outline.
Outline path: 0,47.02 0.76,47.78 13.39,47.78 13.39,57.23 14.6,58.45 64.13,58.45 66.04,56.54 66.04,1.27 64.78,0.01 64.78,0 1.23,0 0,1.23 0,47.02
Stack: Top Layer 0.035mm 外层铜厚1oz / Dielectric1 0.2104mm 7628 RC49% 8.6mil / Inner1 0.0152mm 内层铜厚 / Dielectric2 1.065mm 1.1mm H/HOZ Copper / Inner2 0.0152mm 内层铜厚 / Dielectric3 0.2104mm 7628 RC49% 8.6mil / Bottom Layer 0.035mm 外层铜厚1oz

## Design rules (mm)
template: JLCPCB Capability(Two Layers Board)
spacing copperThickness1oz (default): track to track 0.102, other pairs 0.152 to 0.3
spacing copperThickness2oz: track to track 0.203, other pairs 0.152 to 0.3
track width copperThickness1oz (default): min 0.127, default 0.254, max 2.54
track width copperThickness2oz: min 0.203, default 0.254, max 2.54
differential pair differentialPair (default): width min 0.127, default 0.254, max 2.54; gap min 0.152, default 0.152
via viaSize (default): diameter min 0.5, default 0.61, max 10; hole min 0.3, default 0.305, max 6.3

## Placement (name value [footprint] x y rotation side)
C1  4.7uF  [C0805]  4.44 43.21 0 top
C2  2.2uF  [C0805]  9.53 43.21 0 top
C3  100nF  [C0805]  45.24 35.59 0 top
C4  100nF  [C0805]  22.86 38.76 180 top
C5  100nF  [C0805]  20.96 26.7 90 top
C6  100nF  [C0805]  15.37 23.39 180 bottom
C7  100nF  [C0805]  23.37 41.05 90 bottom
C8  22pF  [C0805]  53.47 30.89 180 top
C9  22pF  [C0805]  57.66 30.89 0 top
C10  100nF  [C0805]  22.35 52.6 180 top
C11  100nF  [C0805]  17.15 52.73 180 top
C12  100uF  [CAP-SMD_BD6.3-L6.6-W6.6-LS7.6-FD-1]  15.24 24.79 270 top
CONN1  -  [MSX 50PIN EDGE CONNECTOR]  33.07 0.43 0 top
Display  PZ254V-11-04P  [HDR-TH_4P-P2.54-V-M]  8.05 35.99 90 top
ICSP  ICSP  [HDR-TH_6P-P2.54-V-M-R2-C3-S2.54]  60.96 49.56 270 top
POWER  POWER  [LED0805-FD]  38.74 56.67 180 top
Q1  BC847  [SOT-23-3_L2.9-W1.3-P1.90-LS2.4-BR]  43.16 21.28 270 bottom
Q2  BC857  [SOT-23-3_L2.9-W1.3-P1.90-LS2.4-BR]  43.14 27.99 270 bottom
Q3  BC847  [SOT-23-3_L2.9-W1.3-P1.90-LS2.4-BR]  43.01 33.07 270 bottom
Q4  BC857  [SOT-23-3_L2.9-W1.3-P1.90-LS2.4-BR]  43.04 39.67 270 bottom
R1  470Ω  [R0805]  31.12 41.94 180 top
R2  470Ω  [R0805]  31.12 44.48 180 top
R3  10kΩ  [R0805]  17.15 55.27 0 top
R4  1kΩ  [R0805]  38.56 52.98 0 top
R5  1kΩ  [R0805]  31.12 39.4 0 top
R6  1kΩ  [R0805]  31.12 47.02 0 top
R7  1kΩ  [R0805]  54.36 48.54 0 top
R8  1kΩ  [R0805]  54.36 44.48 0 top
R9  12kΩ  [R0805]  46.47 21.17 90 bottom
R10  12kΩ  [R0805]  43.06 24.51 180 bottom
R11  12kΩ  [R0805]  46.49 25.68 90 bottom
R12  10kΩ  [R0805]  9.14 26.7 270 bottom
R13  12kΩ  [R0805]  46.42 33.02 90 bottom
R14  12kΩ  [R0805]  43.04 36.27 180 bottom
R15  12kΩ  [R0805]  46.34 37.31 90 bottom
R16  10kΩ  [R0805]  62.23 42.57 270 top
RESET  RESET  [SW-SMD_L3.9-W3.0-P4.45]  22.86 55.27 0 top
RN1  1kΩ  [RES-ARRAY-SMD_0603-8P-L3.2-W1.6-BL]  33.53 35.08 180 bottom
RN2  1kΩ  [RES-ARRAY-SMD_0603-8P-L3.2-W1.6-BL]  29.08 35.08 180 bottom
RN3  1kΩ  [RES-ARRAY-SMD_0603-8P-L3.2-W1.6-BL]  21.46 33.3 270 bottom
RN4  1kΩ  [RES-ARRAY-SMD_0603-8P-L3.2-W1.6-BL]  21.46 29.11 270 bottom
ROM SIZE  MSS-23D18G4 051  [SW-TH_HX-MSS-23D18GX051]  56.51 21.62 0 bottom
RX  TX  [LED0805-FD]  34.93 45.75 270 top
SWITCH GAME  TC-6610-9-260G  [SW-TH_4P-L5.0-W5.0-P4.50-LS6.5]  56.51 36.22 0 top
TX  RX  [LED0805-FD]  34.93 40.67 90 top
U1  B0512S-1WR3  [PWRM-TH_4P-L11.5-W6.1-P2.54_TME1212S]  6.98 46.38 0 top
U2  ATMEGA328P-AU  [TQFP-32_L7.0-W7.0-P0.80-LS9.0-BL]  44.45 43.21 0 top
U3  CH340C  [SOP-16_L10.0-W3.9-P1.27-LS6.0-BL]  22.86 45.75 90 top
U4  W27C512  [PLCC-32_L14.0-W11.4-P1.27-LS15.0-T]  31.98 25.86 90 top
U5  74HC595  [SOP-16_L9.9-W3.9-P1.27-LS6.0-BL]  30.48 41.05 180 bottom
U6  74HC595  [SOP-16_L9.9-W3.9-P1.27-LS6.0-BL]  15.11 30 270 bottom
USB1  MicroXNJ  [MICRO-USB-SMD_MICROXNJ]  30.94 55.47 180 top
X1  16MHz  [OSC-TH_L10.0-W4.5-P5.00]  56.26 27.33 90 top

## Footprints (pads in the part's own frame, mm; a bottom-side part is the same pattern mirrored in y, then rotated)
C0805
  rect 1.41x1.35 smd: 1(-1,0) 2(1,0)
CAP-SMD_BD6.3-L6.6-W6.6-LS7.6-FD-1
  rect 3.5x1.2 smd: 1(-2.67,0) 2(2.67,0)
HDR-TH_4P-P2.54-V-M
  rect 1.7x1.7 hole 1.1: 1(-3.81,0)
  round 1.7 hole 1.1: 2(-1.27,0) 3(1.27,0) 4(3.81,0)
HDR-TH_6P-P2.54-V-M-R2-C3-S2.54
  rect 1.7x1.7 hole 1.1: 1(-2.54,-1.27)
  round 1.7 hole 1.1: 2(-2.54,1.27) 3(0,-1.27) 4(0,1.27) 5(2.54,-1.27) 6(2.54,1.27)
LED0805-FD
  rect 1.3x1.399 smd: 1(-1.05,0) 2(1.05,0)
MICRO-USB-SMD_MICROXNJ
  rect 0.4x1.6 smd: 1(-1.3,1.597) 2(-0.65,1.597) 3(0,1.597) 4(0.65,1.597) 5(1.3,1.597)
  round 1.3 hole 0.7: 6(2.425,1.074) 9(-2.425,1.073)
  oval 1.3x1.8 hole 0.7x1.1: 7(3.625,-1.597) 8(-3.625,-1.597)
MSX 50PIN EDGE CONNECTOR
  custom 1.524x6.858 smd far side: 1(30.442,3.378) 3(27.902,3.378) 5(25.362,3.378) 7(22.822,3.378) 9(20.282,3.378) 11(17.742,3.378) 13(15.202,3.378) 15(12.662,3.378) 17(10.122,3.378) 19(7.582,3.378) 21(5.042,3.378) 23(2.502,3.378) 25(-0.038,3.378) 27(-2.578,3.378) 29(-5.118,3.378) 31(-7.658,3.378) 33(-10.198,3.378) 35(-12.738,3.378) 37(-15.278,3.378) 39(-17.818,3.378) 41(-20.358,3.378) 43(-22.898,3.378) 45(-25.438,3.378) 47(-27.978,3.378) 49(-30.518,3.378)
  custom 1.524x6.858 smd: 2(30.442,3.378) 4(27.902,3.378) 6(25.362,3.378) 8(22.822,3.378) 10(20.282,3.378) 12(17.742,3.378) 14(15.202,3.378) 16(12.662,3.378) 18(10.122,3.378) 20(7.582,3.378) 22(5.042,3.378) 24(2.502,3.378) 26(-0.038,3.378) 28(-2.578,3.378) 30(-5.118,3.378) 32(-7.658,3.378) 34(-10.198,3.378) 36(-12.738,3.378) 38(-15.278,3.378) 40(-17.818,3.378) 42(-20.358,3.378) 44(-22.898,3.378) 46(-25.438,3.378) 48(-27.978,3.378) 50(-30.518,3.378)
OSC-TH_L10.0-W4.5-P5.00
  round 1.6 hole 0.7: 1(0,2.45) 2(0,-2.45)
PLCC-32_L14.0-W11.4-P1.27-LS15.0-T
  rect 0.62x2.4 smd: 1(0,6.805) 2(-1.27,6.805) 3(-2.54,6.805) 4(-3.81,6.805) 14(-3.81,-6.805) 15(-2.54,-6.805) 16(-1.27,-6.805) 17(0,-6.805) 18(1.27,-6.805) 19(2.54,-6.805) 20(3.81,-6.805) 30(3.81,6.805) 31(2.54,6.805) 32(1.27,6.805)
  rect 2.4x0.62 smd: 5(-5.535,5.08) 6(-5.535,3.81) 7(-5.535,2.54) 8(-5.535,1.27) 9(-5.535,0) 10(-5.535,-1.27) 11(-5.535,-2.54) 12(-5.535,-3.81) 13(-5.535,-5.08) 21(5.535,-5.08) 22(5.535,-3.81) 23(5.535,-2.54) 24(5.535,-1.27) 25(5.535,0) 26(5.535,1.27) 27(5.535,2.54) 28(5.535,3.81) 29(5.535,5.08)
PWRM-TH_4P-L11.5-W6.1-P2.54_TME1212S
  rect 1.6x1.6 hole 1: 1(-3.81,0)
  round 1.6 hole 1: 2(-1.27,0) 3(1.27,0) 4(3.81,0)
R0805
  rect 1.133x1.377 smd: 1(-1,0) 2(1,0)
RES-ARRAY-SMD_0603-8P-L3.2-W1.6-BL
  rect 0.65x0.8 smd: 1(-1.2,-0.9) 4(1.2,-0.9) 5(1.2,0.9) 8(-1.2,0.9)
  rect 0.5x0.8 smd: 2(-0.4,-0.9) 3(0.4,-0.9) 6(0.4,0.9) 7(-0.4,0.9)
SOP-16_L9.9-W3.9-P1.27-LS6.0-BL
  oval 0.574x2.038 smd: 1(-4.445,-2.769) 2(-3.175,-2.769) 3(-1.905,-2.769) 4(-0.635,-2.769) 5(0.635,-2.769) 6(1.905,-2.769) 7(3.175,-2.769) 8(4.445,-2.769) 9(4.445,2.769) 10(3.175,2.769) 11(1.905,2.769) 12(0.635,2.769) 13(-0.635,2.769) 14(-1.905,2.769) 15(-3.175,2.769) 16(-4.445,2.769)
SOP-16_L10.0-W3.9-P1.27-LS6.0-BL
  oval 0.56x1.745 smd: 1(-4.445,-2.873) 2(-3.175,-2.873) 3(-1.905,-2.873) 4(-0.635,-2.873) 5(0.635,-2.873) 6(1.905,-2.873) 7(3.175,-2.873) 8(4.445,-2.873) 9(4.445,2.873) 10(3.175,2.873) 11(1.905,2.873) 12(0.635,2.873) 13(-0.635,2.873) 14(-1.905,2.873) 15(-3.175,2.873) 16(-4.445,2.873)
SOT-23-3_L2.9-W1.3-P1.90-LS2.4-BR
  rect 1.25x0.7 smd: 1(1,-0.95) 2(1,0.95) 3(-1,0)
SW-SMD_L3.9-W3.0-P4.45
  rect 1.23x1.36 smd: 1(-2.185,0) 2(2.185,0)
SW-TH_4P-L5.0-W5.0-P4.50-LS6.5
  round 1.8 hole 1.2: 1(-3.25,2.25) 2(3.25,2.25) 3(-3.25,-2.25) 4(3.25,-2.25)
SW-TH_HX-MSS-23D18GX051
  round 1.524 hole 0.914: 1(-4,1.7) 2(-2,1.7) 3(2,1.7) 4(4,1.7) 5(-4,-1.7) 6(-2,-1.7) 7(2,-1.7) 8(4,-1.7)
TQFP-32_L7.0-W7.0-P0.80-LS9.0-BL
  oval 0.45x1.65 smd: 1(-2.8,-4.369) 2(-2,-4.369) 3(-1.2,-4.369) 4(-0.4,-4.369) 5(0.4,-4.369) 6(1.2,-4.369) 7(2,-4.369) 8(2.8,-4.369) 17(2.8,4.369) 18(2,4.369) 19(1.2,4.369) 20(0.4,4.369) 21(-0.4,4.369) 22(-1.2,4.369) 23(-2,4.369) 24(-2.8,4.369)
  oval 1.65x0.45 smd: 9(4.381,-2.8) 10(4.381,-2) 11(4.381,-1.2) 12(4.381,-0.4) 13(4.381,0.4) 14(4.381,1.2) 15(4.381,2) 16(4.381,2.8) 25(-4.381,2.8) 26(-4.381,2) 27(-4.381,1.2) 28(-4.381,0.4) 29(-4.381,-0.4) 30(-4.381,-1.2) 31(-4.381,-2) 32(-4.381,-2.8)

## Nets
As in the schematic, except:
+5V: C1.2 C3.2 C4.2 C5.2 C6.2 C7.2 C12.1 CONN1.47 Display.2 ICSP.2 R3.1 R4.1 R5.1 R6.1 SWITCH GAME.1 SWITCH GAME.2 U1.2 U2.4 U2.6 U2.18 U2.20 U3.16 U4.32 U5.10 U5.16 U6.10 U6.16 USB1.1
GND: C1.1 C2.1 C3.1 C4.1 C5.1 C6.1 C7.1 C8.1 C9.1 C10.1 C12.2 CONN1.41 CONN1.43 Display.1 ICSP.6 POWER.2 Q1.2 Q3.2 R12.1 R16.1 RESET.2 U1.1 U1.3 U2.3 U2.5 U2.21 U3.1 U4.16 U5.8 U5.13 U6.8 U6.13 USB1.5 USB1.6 USB1.7 USB1.8 USB1.9
CS1: CONN1.1 ROM SIZE.4 ROM SIZE.8
CS2: CONN1.2 ROM SIZE.3 ROM SIZE.7
CS12: CONN1.3 ROM SIZE.1 ROM SIZE.5
MCU_A6: R16.2 SWITCH GAME.3 SWITCH GAME.4 U2.19
MCU_D0: R1.1 TX.2 U2.30
MCU_D1: R2.1 RX.2 U2.31
MCU_D11: ICSP.4 R13.1 U2.15
MCU_D12: ICSP.1 R9.1 U2.16
MCU_D13: ICSP.3 R7.1 U2.17
OE: Q4.3 R8.2 ROM SIZE.2 ROM SIZE.6 U4.25
RST: C11.1 ICSP.5 R3.2 RESET.1 U2.29
$3N2905: POWER.1 R4.2
$3N3049: R5.2 TX.1
$3N3143: R6.2 RX.1

Pads without a net: CONN1 5 6 7 8 9 10 11 12 13 14 15 16 18 42 48 49 50; RN4 4 5; U3 7 8 9 10 11 12 14 15; U4 1 12 17 26; U6 7 9; USB1 4

## Via types
v1: diameter 0.61, hole 0.305, Top Layer to Bottom Layer, 135 vias

## Routing (per net, layer and track width the routed paths; a pad name or vN(x,y) marks a point on that pad's centre or on a via; arc(x,y) is an arc through that point)
+5V: length 271.2
  Top Layer w0.254: 44.97,45.11 44.85,45.23 ; R5.1 28.34,37.62 22.41,37.62 21.86,38.16 C4.2 21.7,38.92 21.7,41.18 ; U3.16 21.58,41.3 21.7,41.18 ; 21.7,41.18 v1(21.7,42.05)
  Top Layer w0.406: C5.2 22.11,27.7 22.61,27.2 25.1,27.2 U4.32 ; R6.1 30.23,47.13 30.23,48.54 32.24,50.55 32.24,52.78 ; U2.18 46.45,45.84 45.72,45.11 44.97,45.11 ; 32.24,53.88 32.24,52.78 ; 32.24,52.78 32.44,52.98 35.8,52.98 ; C3.2 45.65,36.17 U2.6 45.65,40.9 44.85,41.7 ; SWITCH GAME.1 SWITCH GAME.2 ; v1(35.81,54.38) 35.81,53 35.8,52.98 ; 44.85,41.7 U2.20 44.85,49.66 v1(44.7,49.81) ; 44.85,41.7 44.05,40.9 U2.4 ; 35.8,52.98 R4.1
  Top Layer w0.61: 5.44,41.68 12.45,41.68 14.48,43.71 14.48,54.64 15.11,55.27 R3.1 ; 5.44,41.68 C1.2 5.72,43.48 U1.2 ; 5.44,41.68 5.44,35.98 6.71,34.72 Display.2 13.31,34.72 15.24,32.79 C12.1 ; C12.1 20.72,27.46 C5.2 ; C12.1 14.74,27.46 v1(14.22,26.95) 12.95,25.68 12.95,18.81 v1(5.09,10.95)
  Inner2 w0.406: ICSP.2 62.23,53.62 61.47,54.38 v1(35.81,54.38) ; v1(21.7,42.05) 21.7,39.54 23.37,37.87 32.51,37.87 35.05,40.41 35.05,46.64 36.44,48.03 44.2,48.03 44.7,48.54 v1(44.7,49.81) 44.7,54.33
  Bottom Layer w0.254: SWITCH GAME.2 59.76,44.04 60.96,45.24 60.96,50.83 ICSP.2 ; 27.22,41.13 27.94,40.41 34.29,40.41 34.93,41.05 U5.16 ; 27.22,41.13 27.31,41.21 U5.10 ; 27.22,41.13 27.22,41.94 ; U6.10 12.4,26.88 14.04,26.88 14.22,26.7 14.22,23.54 C6.2
  Bottom Layer w0.406: Display.2 8.33,34.44 U6.16 14.1,34.44 v1(21.7,42.05) C7.2 27.11,42.05 27.22,41.94
  Bottom Layer w0.61: CONN1.47 v1(5.09,10.95)
+12V: length 69.2
  Top Layer w0.406: U1.4 10.79,43.48 C2.2
  Inner2 w0.406: U1.4 12.73,46.38 16.26,42.85 16.26,38.13 21.78,32.6 41.13,32.6 41.15,32.59 ; v1(41.15,33.81) 41.15,32.59 ; 41.15,32.59 41.15,30.51 41.66,30 41.66,21.87 v1(40.13,20.35)
  Bottom Layer w0.406: v1(41.15,33.81) 42.04,34.7 R14.2 42.04,38.62 Q4.2 ; Q2.2 42.19,24.64 R10.2 42.06,24.05 40.13,22.12 v1(40.13,20.35)
GND: length 312
  Top Layer w0.254: C5.1 20.81,25.55 v1(19.56,25.55) ; C10.1 23.48,52.73 24.76,52.73 25.04,53.01 25.04,55.27 25.4,55.63 25.4,56.54 26.03,57.18 27.21,57.18 USB1.7 ; v1(43.43,52.35) 44.05,51.73 U2.21 44.05,42.17 43.18,41.3 43.18,38.91 U2.3 43.25,37.42 43.81,36.86 43.81,36.01 C3.1 44.85,36.2 U2.5 ; USB1.8 34.56,55.6 USB1.9 ; USB1.8 USB1.7 ; USB1.8 37.28,57.07 POWER.2 ; USB1.7 27.31,55.6 USB1.6 29.03,53.88 USB1.5 ; C8.1 C9.1 56.66,29 v1(56.64,28.98) ; v1(25.15,38.89) 23.99,38.89 C4.1 23.86,40.65 24.38,41.17 25.61,41.17 U3.1 ; R16.1 ICSP.6
  Top Layer w0.406: C12.2 16.51,22.12 v1(16.51,22.12) ; C2.1 8.25,43.48 U1.3
  Top Layer w0.61: C1.1 3.44,46.11 U1.1
  Inner2 w0.254: 42.9,18.31 42.93,18.34 v1(42.93,31.01) ; 42.9,18.31 v1(42.21,18.31) 40.13,18.31 39.37,19.08 39.37,19.31 ; 42.9,18.31 44.7,18.31 52.07,25.68 55.63,25.68 56.64,26.7 v1(56.64,28.98) 56.64,33.3 62.23,38.89 ICSP.6 64.52,49.3 64.52,52.86 60.3,57.07 USB1.8 ; 39.37,19.31 39.37,24 v1(38.78,24.59) ; 39.37,19.31 28.97,19.31 22.73,25.55 v1(19.56,25.55) ; 33.56,52.31 33.6,52.35 v1(43.43,52.35) ; v1(31.5,48.79) 31.5,41.68 28.96,39.14 25.4,39.14 v1(25.15,38.89)
  Inner2 w0.406: v1(31.5,48.79) 33.56,50.86 33.56,54.2 USB1.9
  Bottom Layer w0.254: v1(19.56,25.55) 17.88,25.55 17.82,25.62 15.75,25.62 ; 15.75,25.62 15.75,23.9 ; 15.75,25.62 15.75,29.36 14.48,30.63 U6.13 10.79,30.63 9.25,32.18 Display.1 ; C6.1 16.51,23.25 v1(16.51,22.12) ; Display.1 8.05,30.07 9.14,28.98 R12.1 ; Display.1 7.9,32.03 6.1,32.03 5.22,32.91 5.22,44.48 ; 12.71,15.02 12.88,15.19 ; U5.8 25.4,38.28 25.15,38.53 v1(25.15,38.89) 25.15,39.65 24.75,40.05 C7.1 ; Q3.2 42.06,31.37 42.42,31.01 v1(42.93,31.01) ; 5.22,44.48 7.87,44.48 8.38,44.98 8.38,46.25 U1.3 ; 5.22,44.48 3.68,44.48 3.17,44.98 U1.1 ; Q1.2 v1(42.21,18.31)
  Bottom Layer w0.406: v1(31.5,48.79) 31.12,48.41 31.12,43.82
  Bottom Layer w0.61: v1(16.51,22.12) 16.51,18.82 12.88,15.19 ; CONN1.43 10.17,8.93 10.67,9.42 12.5,9.42 12.71,9.63 ; 12.71,9.63 12.71,15.02 ; 12.71,9.63 CONN1.41
  vias: v1(2.54,38.13) v1(2.54,36.86) v1(2.54,35.59) v1(2.54,34.32) v1(2.54,33.05) v1(10.79,13.36) v1(10.79,12.09) v1(12.06,13.36) v1(12.06,12.09) v1(13.34,38.13) v1(13.34,13.36) v1(13.34,12.09) v1(14.6,36.22) v1(16.54,14) v1(17.78,42.57) v1(17.78,39.4) v1(19.05,22.25) v1(19.05,20.98) v1(19.05,14) v1(19.57,37.02) v1(27.31,50.19) v1(27.31,48.92) v1(31.4,26.57) v1(31.4,24.56) v1(40.64,17.17) v1(42.54,13.36) v1(43.81,13.36) v1(45.72,10.19) v1(46.99,10.19) v1(47.62,52.1) v1(48.26,10.19) v1(49.53,10.19) v1(50.16,56.54) v1(50.86,29.12) v1(51.44,56.54) v1(52.71,56.54) v1(53.97,56.54) v1(55.25,56.54) v1(56.51,56.54) v1(57.15,43.21) v1(57.15,41.94) v1(58.42,43.21) v1(58.42,41.94) v1(63.5,29.87) v1(63.5,28.6) v1(63.5,27.33)
A0: length 33
  Top Layer w0.254: 29.67,10.08 29.67,12.93 34.52,17.78 U4.11 34.73,20.53 v1(34.73,22.25) ; CONN1.28 30.73,4.05 30.73,9.01 29.67,10.08
  Bottom Layer w0.254: RN1.1 v1(34.73,22.25)
A1: length 33.5
  Top Layer w0.254: v1(28.96,8.92) 28.96,13.23 33.27,17.55 33.27,20.3 U4.10 33.25,22.48 v1(33.66,22.89)
  Bottom Layer w0.254: CONN1.27 30.23,4.08 30.23,8.41 29.72,8.92 v1(28.96,8.92) ; RN1.2 33.93,23.16 v1(33.66,22.89)
A2: length 32.7
  Top Layer w0.254: CONN1.30 28.21,4.06 28.21,13.63 31.98,17.4 U4.9 31.98,22.48 v1(32.38,22.89)
  Bottom Layer w0.254: RN1.3 33.31,34 33.31,23.81 v1(32.38,22.89)
A3: length 32.6
  Top Layer w0.254: v1(31.12,22.89) 30.71,22.48 U4.8 30.73,20.3 30.73,18.06 27.43,14.76 v1(27.43,8.92)
  Bottom Layer w0.254: RN1.4 32.33,24.1 v1(31.12,22.89) ; v1(27.43,8.92) 27.69,8.66 27.69,4.08 CONN1.29
A4: length 32.4
  Top Layer w0.254: v1(29.84,22.89) 29.44,22.48 U4.7 29.44,18.03 25.67,14.26 25.67,4.06 CONN1.32
  Bottom Layer w0.254: v1(29.84,22.89) 30.28,23.32 RN2.1
A5: length 32.5
  Top Layer w0.254: v1(28.57,22.89) 28.32,22.63 28.32,20.47 U4.6 28.17,17.78 24.83,14.44 v1(24.83,8.92)
  Bottom Layer w0.254: CONN1.31 25.15,4.08 25.15,8.6 v1(24.83,8.92) ; RN2.2 29.48,23.79 v1(28.57,22.89)
A6: length 47.9
  Top Layer w0.254: v1(28.57,24.16) 28.57,23.79 27.69,22.9 27.69,22.25 27.05,21.62 27.05,20.47 U4.5 ; CONN1.22 38.11,13.73 v1(38.1,13.74)
  Bottom Layer w0.254: RN2.3 28.68,24.26 v1(28.57,24.16) 28.57,24.03 24.89,20.35 24.89,18.31 25.32,17.88 25.32,17.82 25.84,17.3 36.07,17.3 38.1,15.27 v1(38.1,13.74)
A7: length 47
  Top Layer w0.254: v1(23.14,21.95) 23.24,22.05 U4.4 26.47,22.05 27.03,22.61 27.03,23.88 v1(27.31,24.16)
  Bottom Layer w0.254: v1(23.14,21.95) 22.61,21.41 22.61,16.79 24.38,15.01 34.8,15.01 37.59,12.22 37.59,4.33 CONN1.21 ; RN2.4 27.88,24.73 v1(27.31,24.16)
A8: length 47.7
  Top Layer w0.254: v1(37.34,14.25) 37.34,10.44 35.81,8.92 35.81,4.05 CONN1.24 ; v1(23.37,34.5) 25.98,34.5 26.92,33.55 26.92,31.42 26.9,31.39 26.92,31.37 v1(26.92,29.49)
  Bottom Layer w0.254: RN3.1 v1(23.37,34.5) ; v1(26.92,29.49) 26.92,28.22 26.16,27.46 26.16,22.63 24.13,20.6 24.13,17.81 25.4,16.54 35.05,16.54 v1(37.34,14.25)
A9: length 104.9
  Top Layer w0.254: v1(24.13,35.33) 27.18,35.33 28.19,34.32 28.19,31.42 28.17,31.39
  Inner1 w0.254: v1(24.13,35.33) 30.48,35.33 37.34,42.19 38.86,42.19 46.74,50.06 55.5,50.06 56.39,49.17 56.39,44.98 49.02,37.62 49.02,31.01 v1(46.99,28.98)
  Bottom Layer w0.254: RN3.2 23.77,33.7 24.13,34.06 v1(24.13,35.33) ; Q2.3 43.14,28.98 v1(46.99,28.98) 48.01,27.97 48.01,15.52 43.19,10.71 CONN1.17
A10: length 65.1
  Top Layer w0.254: CONN1.20 40.89,4.05 40.89,13.49 v1(40.64,13.74) ; v1(24.89,36.86) 32,36.86 33.27,35.59 33.27,31.42 33.25,31.39
  Inner1 w0.254: v1(24.89,36.86) 24.13,36.86 22.35,35.08 22.35,33.3 25.15,30.51 25.15,22.89 27.18,20.85 32.51,20.85 39.62,13.74 v1(40.64,13.74)
  Bottom Layer w0.254: RN3.3 23.98,32.9 24.89,33.81 v1(24.89,36.86)
A11: length 57.5
  Top Layer w0.254: v1(25.65,36.09) 28.7,36.09 29.46,35.33 29.46,31.42 29.44,31.39
  Bottom Layer w0.254: 25.6,32.1 25.4,31.9 25.4,22.89 23.37,20.85 23.37,17.3 24.89,15.77 34.8,15.77 40.39,10.19 40.39,4.08 CONN1.19 ; 25.6,32.1 RN3.4 ; 25.6,32.1 25.65,32.15 v1(25.65,36.09)
A12: length 44.7
  Top Layer w0.254: U4.3 23.55,23.32 v1(23.37,23.14)
  Bottom Layer w0.254: CONN1.23 35.31,4.08 35.31,9.68 36.07,10.44 36.07,12.98 34.8,14.25 23.62,14.25 21.84,16.03 21.84,21.62 v1(23.37,23.14) 24.64,24.41 24.64,30 24.13,30.51 23.24,30.51 23.04,30.31 RN4.1
A13: length 43.8
  Top Layer w0.254: v1(34.62,9.93) 34.54,9.93 33.29,8.67 33.29,4.06 CONN1.26 ; U4.30 23.4,29.67 v1(23.24,29.51)
  Bottom Layer w0.254: v1(34.62,9.93) 34.62,10.03 35.31,10.72 35.31,12.73 34.54,13.49 23.11,13.49 21.08,15.52 21.08,22.12 23.88,24.92 23.88,29.25 23.62,29.51 v1(23.24,29.51) RN4.2
A14: length 42.4
  Top Layer w0.254: v1(23.24,28.6) 24.97,28.6 U4.31
  Bottom Layer w0.254: RN4.3 23.13,28.71 v1(23.24,28.6) 23.11,28.47 23.11,25.43 20.32,22.63 20.32,15.01 22.61,12.73 34.04,12.73 34.54,12.22 34.54,10.95 32.77,9.17 32.77,4.08 CONN1.25
A15: length 42.5
  Top Layer w0.254: R7.2 55.37,48.52 v1(55.37,48.29) ; U4.2 26.09,24.59 26.42,24.92 26.67,24.92 v1(27.18,25.43)
  Inner1 w0.254: v1(55.37,48.29) 48.52,48.29 42.17,41.94 39.88,41.94 29.21,31.27 29.21,27.46 v1(27.18,25.43)
CE: length 67
  Top Layer w0.254: 36.58,35.84 v1(36.58,39.86) ; 36.58,35.84 34.52,33.78 34.52,31.39 ; 36.58,35.84 41.4,35.84 49.53,27.71 49.53,13.49 53.59,9.42 60.45,9.42 60.97,8.9 CONN1.4 ; U2.26 36.76,45.21 v1(36.58,45.02)
  Bottom Layer w0.254: v1(36.58,39.86) v1(36.58,45.02)
CS1: length 28.3
  Bottom Layer w0.254: 64.77,19.97 64.71,19.92 ROM SIZE.4 ; 64.77,19.97 64.77,10.44 63.75,9.42 63.75,4.05 CONN1.1 ; 64.77,19.97 64.77,22.89 64.34,23.32 ROM SIZE.8
CS2: length 26.9
  Top Layer w0.254: 56.9,19.93 56.9,12.73 59.18,10.44 62.23,10.44 63.51,9.16 CONN1.2 ; 56.9,19.93 56.9,22.63 57.58,23.32 ROM SIZE.7 ; 56.9,19.93 56.91,19.92 ROM SIZE.3
CS12: length 30.5
  Bottom Layer w0.254: 51.05,19.93 51.05,22.89 51.56,23.39 52.44,23.39 ROM SIZE.5 ; 51.05,19.93 51.05,12.47 52.83,10.69 59.96,10.69 60.97,9.68 CONN1.3 ; 51.05,19.93 51.06,19.92 ROM SIZE.1
D0: length 56.4
  Top Layer w0.254: CONN1.34 23.11,4.05 23.11,15.52 25.65,18.06 v1(25.91,18.06) ; v1(37.08,18.06) 37.08,20.3 U4.13 ; v1(39.12,39.14) 39.37,39.14 39.88,39.65 39.88,40.21 U2.32
  Inner1 w0.254: v1(39.12,39.14) 32.77,32.79 32.77,25.93 37.08,21.62 v1(37.08,18.06)
  Bottom Layer w0.254: v1(25.91,18.06) v1(37.08,18.06)
D1: length 55.1
  Top Layer w0.254: U4.14 38.61,21.87 v1(38.61,21.11) 38.61,18.31 37.59,17.3 35.56,17.3 31.24,12.98 v1(31.24,9.68) ; v1(39.37,38.13) 40.94,38.13 U2.1
  Inner1 w0.254: v1(38.61,21.11) 33.53,26.19 33.53,32.28 v1(39.37,38.13)
  Bottom Layer w0.254: v1(31.24,9.68) 23.11,9.68 22.61,9.17 22.61,4.08 CONN1.33
D2: length 56.9
  Top Layer w0.254: v1(39.12,36.86) 41.66,36.86 42.45,37.65 U2.2 ; v1(37.05,23.61) 37.34,23.32 U4.15 ; CONN1.36 20.83,4.31 20.83,16.03 23.62,18.82 v1(25.91,18.82)
  Inner1 w0.254: v1(37.05,23.61) 37.05,23.69 34.54,26.19 34.54,32.28 v1(39.12,36.86)
  Bottom Layer w0.254: v1(25.91,18.82) 36.07,18.82 37.05,19.8 v1(37.05,23.61)
D3: length 62.1
  Top Layer w0.254: U4.18 38.96,26.95 v1(40.89,26.95) 40.89,19.58 37.85,16.54 35.81,16.54 32,12.73 v1(32,10.44) ; v1(50.55,40.41) 50.54,40.41 U2.9
  Inner1 w0.254: v1(40.89,26.95) 43.43,26.95 47.95,31.46 47.95,37.81 v1(50.55,40.41)
  Bottom Layer w0.254: CONN1.35 20.33,9.69 21.08,10.44 v1(32,10.44)
D4: length 64.4
  Top Layer w0.254: v1(25.91,19.58) 22.35,19.58 17.79,15.02 CONN1.38 ; U2.10 v1(50.55,41.21)
  Inner1 w0.254: v1(38.78,28.4) 38.86,28.47 42.93,28.47 46.74,32.28 46.74,38.38 49.56,41.21 v1(50.55,41.21)
  Bottom Layer w0.254: v1(25.91,19.58) 35.28,19.58 36.32,20.63 36.32,27.97 36.75,28.4 v1(38.78,28.4)
D5: length 72.9
  Top Layer w0.254: 38.81,29.67 U4.20 ; 38.81,29.67 42.75,29.67 43.94,28.47 43.94,17.04 42.67,15.77 36.07,15.77 32.77,12.47 v1(32.77,11.2) ; 38.81,29.67 v1(38.86,29.62) ; U2.11 v1(50.55,42.01)
  Inner1 w0.254: v1(50.55,42.01) 50.48,41.94 49.02,41.94 45.47,38.38 45.47,36.75 38.86,30.14 v1(38.86,29.62)
  Bottom Layer w0.254: v1(32.77,11.2) 19.05,11.2 18.29,10.44 18.29,4.3 CONN1.37
D6: length 64.7
  Top Layer w0.254: v1(25.91,20.35) 21.34,20.35 15.25,14.26 CONN1.40 ; U2.12 v1(50.55,42.81)
  Inner1 w0.254: v1(37.06,31.39) 37.06,31.75 48.11,42.81 v1(50.55,42.81)
  Bottom Layer w0.254: v1(25.91,20.35) 34.8,20.35 35.56,21.11 35.56,28.47 37.08,30 37.08,31.37 v1(37.06,31.39)
D7: length 80.4
  Top Layer w0.254: v1(33.5,11.93) 33.5,12.19 36.32,15.01 43.18,15.01 44.96,16.79 44.96,28.73 43.42,30.27 41.89,30.27 38.61,33.55 v1(37.34,33.55) 36.32,33.55 35.79,33.02 35.79,31.39 ; v1(46.99,43.71) 48.72,43.71 U2.13
  Inner1 w0.254: v1(46.99,43.71) 46.99,43.21 v1(37.34,33.55)
  Bottom Layer w0.254: CONN1.39 15.25,10.96 16.22,11.93 v1(33.5,11.93)
MCU_A0: length 16.5
  Top Layer w0.254: U2.23 v1(42.45,49.05)
  Bottom Layer w0.254: v1(42.45,49.05) 32.77,49.05 32.51,48.79 32.51,43.94 U5.14
MCU_A1: length 43.7
  Top Layer w0.254: U2.24 41.66,47.58 v1(41.66,49.89)
  Inner1 w0.254: v1(13.97,29.24) 26.16,41.43 v1(28.45,41.43)
  Bottom Layer w0.254: v1(13.97,29.24) 13.84,29.36 U6.12 ; v1(28.45,41.43) 29.84,42.82 U5.12 29.97,43.94 29.97,48.79 31.06,49.89 v1(41.66,49.89)
MCU_A2: length 50
  Top Layer w0.254: U2.25 v1(40.07,50.83)
  Inner1 w0.254: v1(28.7,45.75) 29.72,44.73 29.72,40.67 27.18,38.13 24.24,38.13 14.33,28.22 v1(13.97,28.22)
  Bottom Layer w0.254: U5.11 28.7,43.94 v1(28.7,45.75) 28.7,48.54 30.99,50.83 v1(40.07,50.83) ; v1(13.97,28.22) 12.47,28.22 U6.11
MCU_A4: length 37.2
  Top Layer w0.254: U2.27 v1(38.61,44.41)
  Inner1 w0.254: Display.4 11.07,39.8 18.54,47.27 37.23,47.27 38.61,45.89 v1(38.61,44.41)
MCU_A5: length 37
  Top Layer w0.254: U2.28 v1(38.61,43.61)
  Inner1 w0.254: Display.3 8.41,37.62 11.18,37.62 20.07,46.51 29.97,46.51 32.87,43.61 v1(38.61,43.61)
MCU_A6: length 54.2
  Top Layer w0.254: U2.19 45.72,47.64 45.72,52.86 46.99,54.13 63.5,54.13 64.26,53.37 64.26,42.19 63.64,41.57 R16.2 62.23,34.82 61.38,33.97 SWITCH GAME.4 SWITCH GAME.3
MCU_A7: length 85.2
  Top Layer w0.254: U2.22 v1(43.25,50.83)
  Inner1 w0.254: v1(7.62,25.93) 7.37,25.93 5.59,27.71 5.59,39.65 7.37,41.43 10.67,41.43 21.08,51.84 42.23,51.84 v1(43.25,50.83)
  Bottom Layer w0.254: v1(7.62,25.93) 8.91,25.93 R12.2 9.14,11.96 7.63,10.45 CONN1.45
MCU_D0: length 8.2
  Top Layer w0.254: U2.30 40,41.94 36.83,41.94 36.61,41.72 TX.2 34.71,41.94 R1.1
MCU_D1: length 11
  Top Layer w0.254: U2.31 37.62,41.21 v1(37.59,41.17) ; v1(37.16,44.22) 35.4,44.22 RX.2 34.71,44.48 R2.1
  Bottom Layer w0.254: v1(37.16,44.22) 37.16,41.61 v1(37.59,41.17)
MCU_D10: length 4.6
  Top Layer w0.254: R8.1 53.29,44.41 U2.14
MCU_D11: length 55.7
  Top Layer w0.254: ICSP.4 62.23,50.32 61.72,50.83 50.8,50.83 50.29,50.32 50.29,45.49 50.01,45.21 U2.15
  Bottom Layer w0.254: R13.1 62.47,32.02 64.26,33.81 64.26,48.79 63.25,49.81 62.48,49.81 ICSP.4
MCU_D12: length 57.5
  Top Layer w0.254: U2.16 48.83,51.14 49.78,52.1 ICSP.1
  Inner1 w0.254: v1(46.48,18.82) 46.48,26.7 50.29,30.51 50.29,37.87 57.15,44.73 57.15,51.33 57.91,52.1 ICSP.1
  Bottom Layer w0.254: R9.1 46.47,18.83 v1(46.48,18.82)
MCU_D13: length 15.6
  Top Layer w0.254: ICSP.3 59.18,50.06 53.85,50.06 53.36,49.57 R7.1 52.85,49.05 v1(51.31,49.05) ; U2.17 v1(47.25,49.05)
  Bottom Layer w0.254: v1(47.25,49.05) v1(51.31,49.05)
OE: length 89.8
  Top Layer w0.254: v1(31.24,28.22) 31.98,28.96 31.98,31.39 ; v1(55.12,46.25) 55.12,44.71 R8.2
  Inner1 w0.254: v1(55.12,46.25) 48.26,46.25 43.18,41.17 40.13,41.17 31.24,32.28 v1(31.24,28.22)
  Bottom Layer w0.254: v1(55.12,46.25) 43.94,46.25 43.04,45.35 Q4.3 43.03,40.67 41.15,40.67 40.13,39.65 40.13,35.33 39.37,34.57 39.37,31.78 40.89,30.25 47.58,30.25 ROM SIZE.6 ROM SIZE.2
RST: length 59.7
  Top Layer w0.254: U2.29 v1(41.66,42.81) ; v1(22.1,55.14) 20.8,55.14 RESET.1 R3.2 C11.1
  Bottom Layer w0.254: 45.7,47.27 42.93,47.27 41.66,46 v1(41.66,42.81) ; 45.7,47.27 45.7,52.08 44.49,53.29 24.71,53.29 22.86,55.14 v1(22.1,55.14) ; 45.7,47.27 59.44,47.27 ICSP.5
UD+: length 14.9
  Top Layer w0.254: U3.5 25.61,46.51 24.38,46.51 23.88,47.02 23.88,50.32 24.64,51.08 29.72,51.08 30.94,52.3 USB1.3
UD-: length 9.9
  Top Layer w0.254: USB1.2 31.62,53.84 31.62,51.46 27.81,47.65 U3.6
$3N645: length 4.6
  Top Layer w0.254: U3.2 28.57,42.57 29.21,41.94 R1.2
$3N684: length 4.6
  Top Layer w0.254: R2.2 29.21,44.48 28.57,43.84 U3.3
$3N1092: length 17.5
  Top Layer w0.254: X1.1 52.47,28.67 C8.2 52.34,30.76 50.29,30.76 49.78,31.27 49.78,36.35 49.28,36.86 46.74,36.86 46.48,37.11 46.48,38.8 U2.7
$3N1096: length 21.9
  Top Layer w0.254: 58.71,27.33 58.66,27.38 C9.2 58.67,30.9 58.67,32.03 58.42,32.28 51.82,32.28 50.8,33.3 50.8,38.38 50.34,38.84 U2.8
$3N2382: length 10.1
  Top Layer w0.254: U3.4 24.38,45.11 22.35,47.14 22.35,50.83 21.35,51.83 C10.2
$3N2455: length 11.2
  Top Layer w0.254: U3.13 16.51,45.11 16.15,45.48 C11.2
$3N2905: length 3.8
  Top Layer w0.254: R4.2 39.79,53.21 POWER.1
$3N3049: length 2.9
  Top Layer w0.254: TX.1 32.33,39.61 R5.2
$3N3143: length 2.9
  Top Layer w0.254: R6.2 34.71,47.02 RX.1
$4N1047: length 31.5
  Bottom Layer w0.254: U6.14 12.22,32.03 11.18,32.03 9.65,33.55 6.86,33.55 6.42,33.99 6.42,35.59 6.93,36.09 12.95,36.09 20.83,43.97 25.88,43.97 U5.9
$4N1502: length 15.1
  Bottom Layer w0.254: 35.05,36.09 35.81,36.86 35.81,46 35.31,46.51 34.04,46.51 33.66,46.13 U5.15
$4N2627: length 5
  Bottom Layer w0.254: R11.2 46.18,26.99 Q2.1 44.09,24.54 R10.1
$4N2636: length 4.3
  Bottom Layer w0.254: R11.1 44.09,22.28 Q1.3
$4N2638: length 3.1
  Bottom Layer w0.254: Q1.1 44.58,20.28 R9.2
$4N3090: length 4.9
  Bottom Layer w0.254: R14.1 43.99,36.32 Q4.1 45.98,38.67 R15.2
$4N3092: length 4.3
  Bottom Layer w0.254: R15.1 44.1,34.07 Q3.3
$4N3094: length 3.3
  Bottom Layer w0.254: R13.2 44.47,32.07 Q3.1
$4N6754: length 9.5
  Bottom Layer w0.254: RN3.8 19.73,35.33 16.26,35.33 14.1,33.17 12.34,33.17
$4N6776: length 2.3
  Bottom Layer w0.254: 30.48,36.22 31.12,36.86 31.12,38.28
$4N6780: length 2.4
  Bottom Layer w0.254: U5.5 29.84,36.86 29.48,36.49 RN2.7
$4N6785: length 2.3
  Bottom Layer w0.254: RN2.6 28.57,36.09 U5.6
$4N6790: length 2.3
  Bottom Layer w0.254: 27.94,36.22 27.31,36.86 U5.7
$4N6819: length 2.3
  Bottom Layer w0.254: RN1.5 32.38,36.03 U5.3
$4N6825: length 2.6
  Bottom Layer w0.254: RN1.6 33.02,36.09 33.02,36.86 33.66,37.49 U5.2
$4N6841: length 2.7
  Bottom Layer w0.254: U5.1 34.93,37.49 33.93,36.49 RN1.7
$4N6896: length 2.8
  Bottom Layer w0.254: RN3.5 19.63,32.1 19.43,31.9 U6.3
$4N6902: length 2.9
  Bottom Layer w0.254: 17.88,33.17 19.18,33.17 19.56,32.79 20.46,32.79 RN3.6
$4N6909: length 3
  Bottom Layer w0.254: U6.1 19.18,34.44 19.92,33.7 RN3.7
$4N6933: length 2.9
  Bottom Layer w0.254: U6.4 19.43,30.63 19.81,30.25 20.51,30.25 RN4.8
$4N6938: length 2.7
  Bottom Layer w0.254: RN4.7 20.42,29.36 U6.5
$4N6943: length 2.9
  Bottom Layer w0.254: U6.6 19.18,28.09 19.79,28.71 RN4.6
$5N778: length 13.4
  Top Layer w0.254: CONN1.46 7.63,7.25
  Top Layer w0.406: CONN1.44 10.16,3.82 10.16,8.92 9.4,9.68 8.38,9.68 7.63,8.93 7.63,7.25

## Copper pours and planes (outline as drawn; the poured copper is in the pictures)
GND on Top Layer: 0,58.45 66.04,58.45 66.04,7.76 0,7.76
GND on Bottom Layer: 0,58.45 66.04,58.45 66.04,7.76 0,7.76
GND on Inner1: 0,58.45 66.04,58.45 66.04,7.78 0,7.78
GND on Inner2: 0,58.45 66.04,58.45 66.04,7.78 0,7.78

## Text on the board
Bottom Silkscreen Layer: LINK Cartridge | V1.1. Designed by Wells Wang, 2025. Released under GPL v3 License. | geek-logic.com | CS12 | CS2 | CS1
Top Silkscreen Layer: LINK Cartridge | V1.1. Designed by Wells Wang, 2025. Released under GPL v3 License. | geek-logic.com | SDA | SCK | GND | VCC
